# EAGLE design source_eagle (EAGLE 9.2.2)
COMPANY: ADAFRUIT INDUSTRIES; DRAWN: KTOWN; REV: B
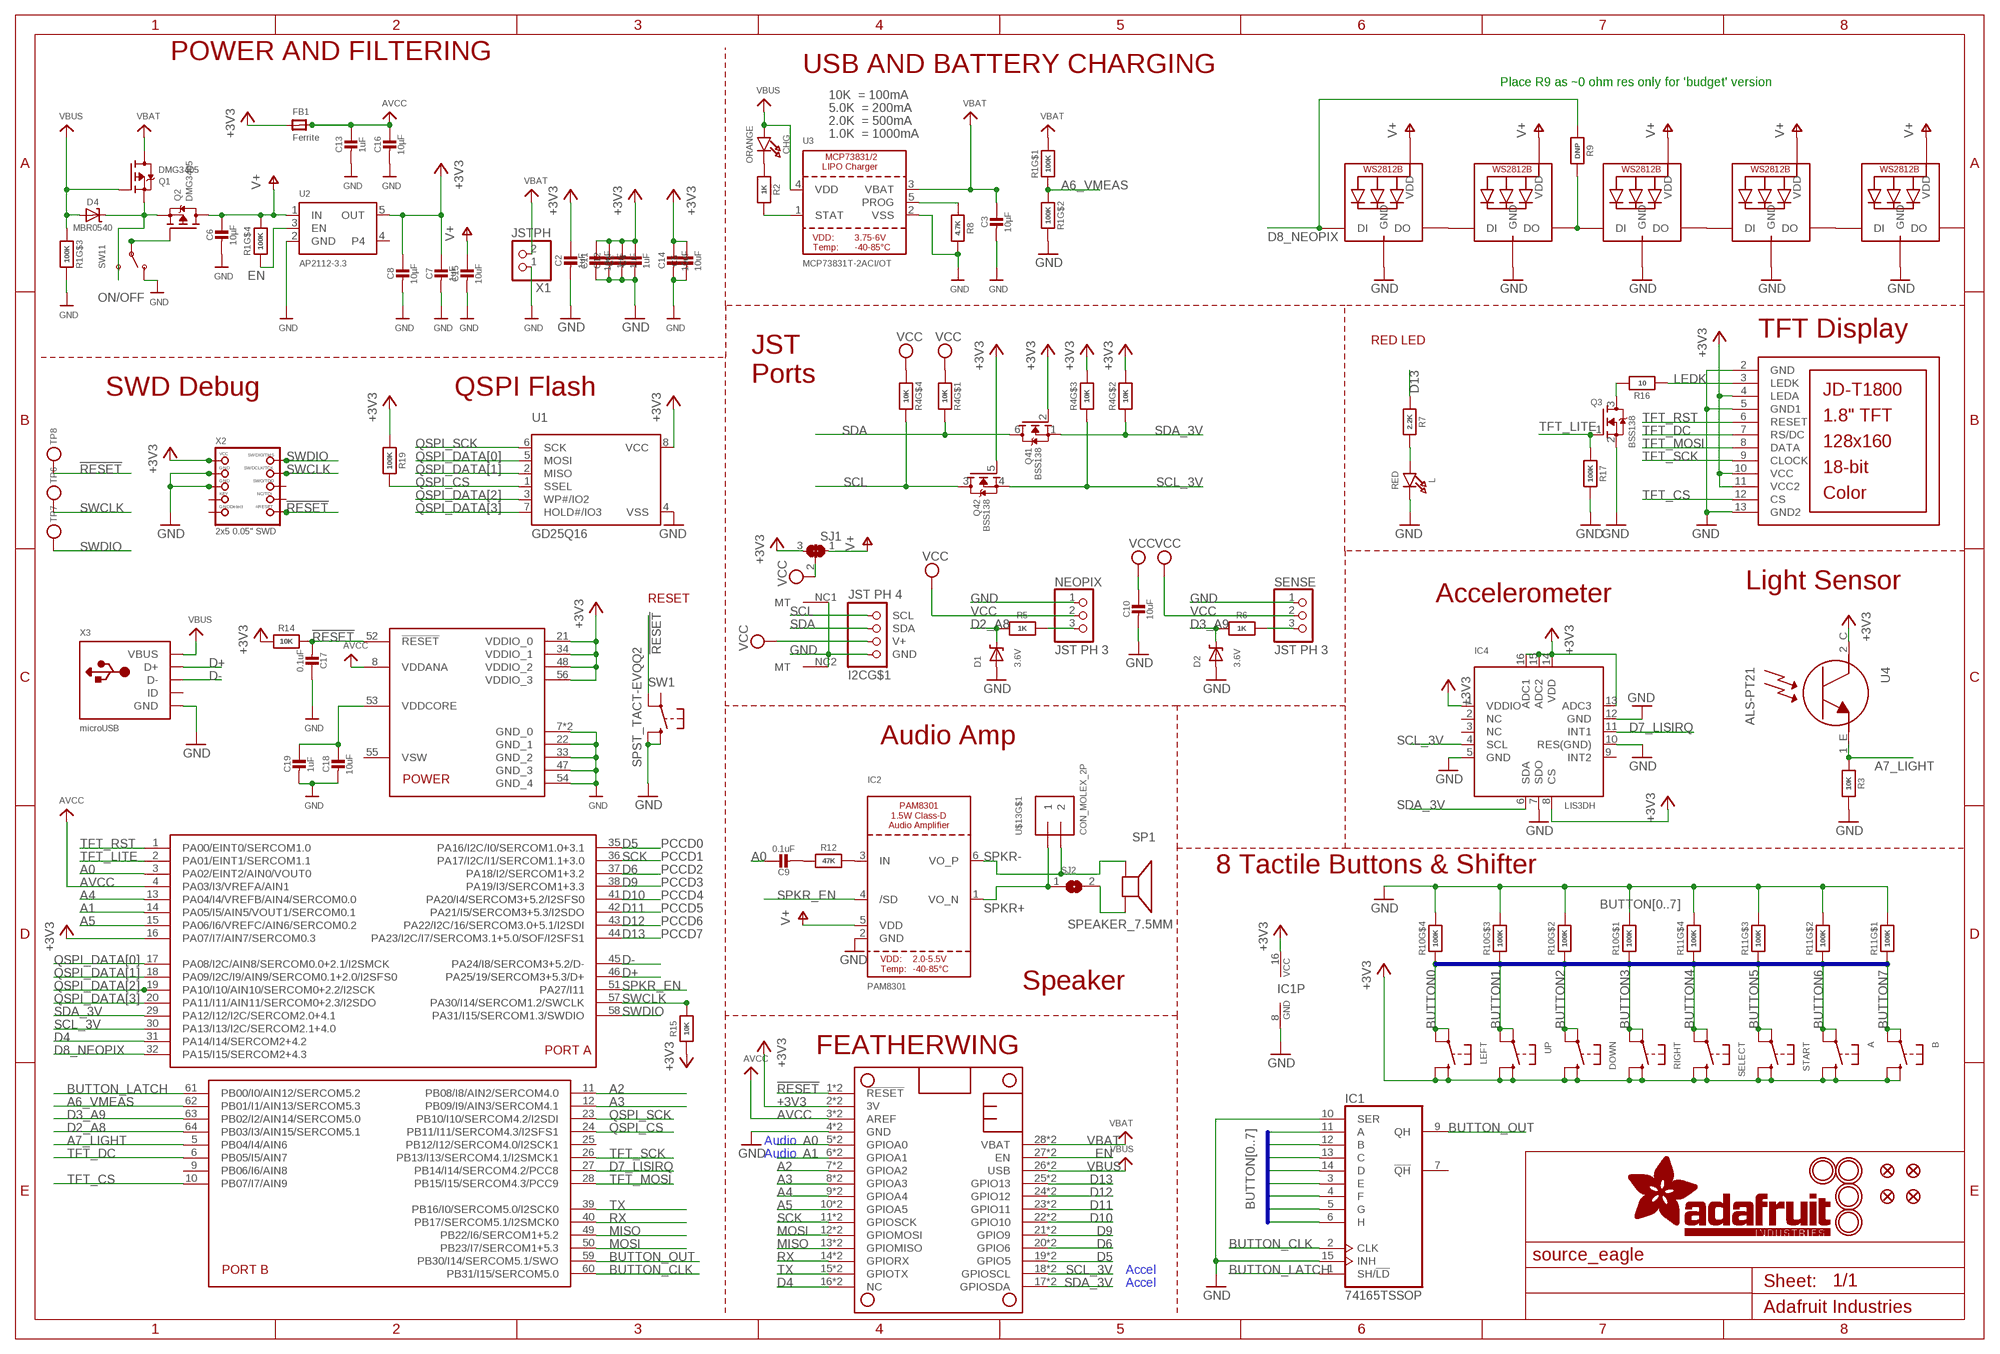
[diagram p0: schematic, sheet 1]

## Parts
A  SWITCH_TACT_SMT_6MMSMALL  [6MM_SMT]
B  SWITCH_TACT_SMT_6MMSMALL  [6MM_SMT]
C1  1uF  CAP_CERAMIC0603_NO  [0603-NO]
C2  1uF  CAP_CERAMIC0603_NO  [0603-NO]
C3  10µF  CAP_CERAMIC0805-NOOUTLINE  [0805-NO]
C4  1uF  CAP_CERAMIC0603_NO  [0603-NO]
C5  10uF  CAP_CERAMIC0805-NOOUTLINE  [0805-NO]
C6  10µF  CAP_CERAMIC0805-NOOUTLINE  [0805-NO]
C7  1uF  CAP_CERAMIC0603_NO  [0603-NO]
C8  10µF  CAP_CERAMIC0805-NOOUTLINE  [0805-NO]
C9  0.1uF  CAP_CERAMIC0603_NO  [0603-NO]
C10  10uF  CAP_CERAMIC0805-NOOUTLINE  [0805-NO]
C11  10uF  CAP_CERAMIC0805-NOOUTLINE  [0805-NO]
C12  1uF  CAP_CERAMIC0603_NO  [0603-NO]
C13  1uF  CAP_CERAMIC0603_NO  [0603-NO]
C14  10uF  CAP_CERAMIC0805-NOOUTLINE  [0805-NO]
C15  10uF  CAP_CERAMIC0805-NOOUTLINE  [0805-NO]
C16  10µF  CAP_CERAMIC_0805MP  [_0805MP]
C17  0.1uF  CAP_CERAMIC0603_NO  [0603-NO]
C18  10uF  CAP_CERAMIC0805-NOOUTLINE  [0805-NO]
C19  1uF  CAP_CERAMIC0603_NO  [0603-NO]
CHG  ORANGE  LED0805_NOOUTLINE  [CHIPLED_0805_NOOUTLINE]
D1  3.6V  DIODE-ZENERSOD323  [SOD-323]
D2  3.6V  DIODE-ZENERSOD323  [SOD-323]
D4  MBR0540  DIODE-SCHOTTKYSOD-123  [SOD-123]
DOWN  SWITCH_TACT_SMT_6MMSMALL  [6MM_SMT]
FB1  Ferrite  FERRITE-0805NO  [0805-NO]
I2C  JST PH 4  STEMMA_I2C_RASMT  [JSTPH4]
IC1  74165TSSOP  [TSSOP16]
IC2  PAM8301  [SOT23-6]
IC4  LIS3DH  ACCEL_LIS3DHTR  [LGA16_3X3MM]
L  RED  LED0805_NOOUTLINE  [CHIPLED_0805_NOOUTLINE]
LCD1  DISP_LCD_JDT1800  [JD-T1800]
LED1  WS2812B3535  [LED3535]
LED2  WS2812B3535  [LED3535]
LED3  WS2812B3535  [LED3535]
LED4  WS2812B3535  [LED3535]
LED5  WS2812B3535  [LED3535]
LEFT  SWITCH_TACT_SMT_6MMSMALL  [6MM_SMT]
MS1  FEATHERWING_SMTDUALNOHOLES  [FEATHERWING_SMT_NOHOLES]
NEOPIX  JST PH 3  CON_JST_PH_3PIN  [JSTPH3]
Q1  DMG3405  MOSFET-P  [SOT23-R]
Q2  DMG3405  MOSFET-P  [SOT23-R]
Q3  BSS138  MOSFET-NWIDE  [SOT23-WIDE]
Q4  BSS138  MOSFET-N_DUAL  [SOT363]
R1  100K  RESISTOR_4PACK  [RESPACK_4X0603]
R2  1K  RESISTOR_0603_NOOUT  [0603-NO]
R3  10K  RESISTOR_0603_NOOUT  [0603-NO]
R4  10K  RESISTOR_4PACK  [RESPACK_4X0603]
R5  1K  RESISTOR_0603_NOOUT  [0603-NO]
R6  1K  RESISTOR_0603_NOOUT  [0603-NO]
R7  2.2K  RESISTOR_0603_NOOUT  [0603-NO]
R8  4.7K  RESISTOR_0603_NOOUT  [0603-NO]
R9  DNP  RESISTOR_0603_NOOUT  [0603-NO]
R10  100K  RESISTOR_4PACK  [RESPACK_4X0603]
R11  100K  RESISTOR_4PACK  [RESPACK_4X0603]
R12  47K  RESISTOR_0603_NOOUT  [0603-NO]
R14  10K  RESISTOR_0603_NOOUT  [0603-NO]
R15  10K  RESISTOR_0603_NOOUT  [0603-NO]
R16  10  RESISTOR_0603_NOOUT  [0603-NO]
R17  100K  RESISTOR_0603_NOOUT  [0603-NO]
R19  100K  RESISTOR_0603_NOOUT  [0603-NO]
RIGHT  SWITCH_TACT_SMT_6MMSMALL  [6MM_SMT]
SELECT  SWITCH_TACT_SMT_6MMSMALL  [6MM_SMT]
SENSE  JST PH 3  CON_JST_PH_3PIN  [JSTPH3]
SJ1  SOLDERJUMPER_2WAY  [SOLDERJUMPER_2WAY_OPEN_NOPASTE]
SJ2  SOLDERJUMPERCLOSED  [SOLDERJUMPER_CLOSEDWIRE]
SP1  SPEAKER_7.5MM  [BUZZER_SMT_7.5MM]
START  SWITCH_TACT_SMT_6MMSMALL  [6MM_SMT]
SW1  SPST_TACT-EVQQ2  SWITCH_TACT_SMT_EVQQ2_SMALL  [EVQ-Q2_SMALLER]
SW11  SWITCH_SPDT  [SPDT_SMT_SSSS811101]
TP6  TESTPOINTROUND2MM  [TESTPOINT_ROUND_2MM]
TP7  TESTPOINTROUND2MM  [TESTPOINT_ROUND_2MM]
TP8  TESTPOINTROUND2MM  [TESTPOINT_ROUND_2MM]
U1  GD25Q16  SPIFLASH_8PIN208MIL  [SOIC8_208MIL]
U2  AP2112-3.3  VREG_SOT23-5  [SOT23-5]
U3  MCP73831T-2ACI/OT  MCP73831/2  [SOT23-5]
U4  ALS-PT21  PHOTOTRANSISTOR_PT26-21C  [ALS-PT26-21C]
U$5  MOUNTINGHOLE3.0THIN  [MOUNTINGHOLE_3.0_PLATEDTHIN]
U$6  MOUNTINGHOLE3.0THIN  [MOUNTINGHOLE_3.0_PLATEDTHIN]
U$13  CON_MOLEX_2P  [53398-0271]
U$15  MOUNTINGHOLE3.0THIN  [MOUNTINGHOLE_3.0_PLATEDTHIN]
U$17  MOUNTINGHOLE3.0THIN  [MOUNTINGHOLE_3.0_PLATEDTHIN]
U$24  ATSAMD51J19  ATSAMD51J  [PQFN64-1]
U$34  FIDUCIAL_1MM  [FIDUCIAL_1MM]
U$35  FIDUCIAL_1MM  [FIDUCIAL_1MM]
U$42  FIDUCIAL_1MM  [FIDUCIAL_1MM]
U$43  FIDUCIAL_1MM  [FIDUCIAL_1MM]
UP  SWITCH_TACT_SMT_6MMSMALL  [6MM_SMT]
X1  JSTPH  CON_JST_PH_2PIN  [JSTPH2]
X2  2x5 0.05" SWD  JTAG-CORTEXBOXPOSTS  [2X05_1.27MM_BOX_POSTS]
X3  microUSB  USB_MICRO_20329_V2  [4UCONN_20329_V2]

## Nets
!RESET: C17.2 MS1.1(!RESET) MS1.1B(!RESET) R14.2 SW1.A'(P1) TP8.P$1 U$24.52(!RESET) X2.10(NRESET)
+3V3 [power]: A.B'(S1) A.B(S) B.B'(S1) B.B(S) C1.1 C2.1 C4.1 C5.1 C7.1 C8.1 C11.1 C12.1 C14.1 DOWN.B'(S1) DOWN.B(S) FB1.1 IC1.16(VCC) IC4.1(VDDIO) IC4.8(CS) IC4.13(ADC3) IC4.14(VDD) IC4.15(ADC2) IC4.16(ADC1) LCD1.4(LEDA) LCD1.10(VCC) LCD1.11(VCC2) LEFT.B'(S1) LEFT.B(S) MS1.2(3V) MS1.2B(3V) Q4.2(1:G) Q4.5(2:G) R4.2 R4.3 R14.1 R15.1 R19.1 RIGHT.B'(S1) RIGHT.B(S) SELECT.B'(S1) SELECT.B(S) SJ1.3 START.B'(S1) START.B(S) U1.8(VCC) U2.5(OUT) U4.2_C(C) U$24.16(PA07/I7/AIN7/SERCOM0.3) U$24.21(VDDIO_0) U$24.34(VDDIO_1) U$24.48(VDDIO_2) U$24.56(VDDIO_3) UP.B'(S1) UP.B(S) X2.1(VCC)
A0: C9.1 MS1.5(GPIOA0) MS1.5B(GPIOA0) U$24.3(PA02/EINT2/AIN0/VOUT0)
A1: MS1.6(GPIOA1) MS1.6B(GPIOA1) U$24.14(PA05/I5/AIN5/VOUT1/SERCOM0.1)
A2: MS1.7(GPIOA2) MS1.7B(GPIOA2) U$24.11(PB08/I8/AIN2/SERCOM4.0)
A3: MS1.8(GPIOA3) MS1.8B(GPIOA3) U$24.12(PB09/I9/AIN3/SERCOM4.1)
A4: MS1.9(GPIOA4) MS1.9B(GPIOA4) U$24.13(PA04/I4/VREFB/AIN4/SERCOM0.0)
A5: MS1.10(GPIOA5) MS1.10B(GPIOA5) U$24.15(PA06/I6/VREFC/AIN6/SERCOM0.2)
A6_VMEAS: R1.1 R1.2 U$24.62(PB01/I1/AIN13/SERCOM5.3)
A7_LIGHT: R3.2 U4.1_E(E) U$24.5(PB04/I4/AIN6)
AVCC: C13.1 C16.1 FB1.2 MS1.3(AREF) MS1.3B(AREF) U$24.4(PA03/I3/VREFA/AIN1) U$24.8(VDDANA)
BUTTON0: IC1.11(A) LEFT.A'(P1) LEFT.A(P) R10.4
BUTTON1: IC1.12(B) R10.3 UP.A'(P1) UP.A(P)
BUTTON2: DOWN.A'(P1) DOWN.A(P) IC1.13(C) R10.2
BUTTON3: IC1.14(D) R10.1 RIGHT.A'(P1) RIGHT.A(P)
BUTTON4: IC1.3(E) R11.4 SELECT.A'(P1) SELECT.A(P)
BUTTON5: IC1.4(F) R11.3 START.A'(P1) START.A(P)
BUTTON6: A.A'(P1) A.A(P) IC1.5(G) R11.2
BUTTON7: B.A'(P1) B.A(P) IC1.6(H) R11.1
BUTTON_CLK: IC1.2(CLK) U$24.60(PB31/I15/SERCOM5.0)
BUTTON_LATCH: IC1.1(SH/!LD) U$24.61(PB00/I0/AIN12/SERCOM5.2)
BUTTON_OUT: IC1.9(QH) U$24.59(PB30/I14/SERCOM5.1/SWO)
CHG_LED: R2.2 U3.1(STAT)
CHG_RATE: R8.1 U3.5(PROG)
D2_: NEOPIX.3 R5.1
D2_A8: D1.C R5.2 U$24.64(PB03/I3/AIN15/SERCOM5.1)
D3_: R6.1 SENSE.3
D3_A9: D2.C R6.2 U$24.63(PB02/I2/AIN14/SERCOM5.0)
D4: MS1.16(NC) MS1.16B(NC) U$24.31(PA14/I14/SERCOM2+4.2)
D5: MS1.19(GPIO5) MS1.19B(GPIO5) U$24.35(PA16/I2C/I0/SERCOM1.0+3.1)
D6: MS1.20(GPIO6) MS1.20B(GPIO6) U$24.37(PA18/I2/SERCOM1+3.2)
D7_LISIRQ: IC4.11(INT1) U$24.27(PB14/I14/SERCOM4.2/PCC8)
D8_NEOPIX: LED1.1(DI) R9.1 U$24.32(PA15/I15/SERCOM2+4.3)
D9: MS1.21(GPIO9) MS1.21B(GPIO9) U$24.38(PA19/I3/SERCOM1+3.3)
D10: MS1.22(GPIO10) MS1.22B(GPIO10) U$24.41(PA20/I4/SERCOM3+5.2/I2SFS0)
D11: MS1.23(GPIO11) MS1.23B(GPIO11) U$24.42(PA21/I5/SERCOM3+5.3/I2SDO)
D12: MS1.24(GPIO12) MS1.24B(GPIO12) U$24.43(PA22/I2C/16/SERCOM3.0+5.1/I2SDI)
D13: MS1.25(GPIO13) MS1.25B(GPIO13) R7.1 U$24.44(PA23/I2C/I7/SERCOM3.1+5.0/SOF/I2SFS1)
D+: U$24.46(PA25/19/SERCOM3+5.3/D+) X3.D+
D-: U$24.45(PA24/I8/SERCOM3+5.2/D-) X3.D-
EN: MS1.27(EN) MS1.27B(EN) R1.4 U2.3(EN)
GND: C1.2 C2.2 C3.2 C4.2 C5.2 C6.2 C7.2 C8.2 C10.2 C11.2 C12.2 C13.2 C14.2 C15.2 C16.2 C17.1 C18.2 C19.2 D1.A D2.A I2C.1(GND) I2C.NC1(MT) I2C.NC2(MT) IC1.8(GND) IC1.10(SER) IC1.15(INH) IC2.2(GND) IC4.5(GND) IC4.7(SDO) IC4.10(RES(GND)) IC4.12(GND) L.C LCD1.2(GND) LCD1.5(GND1) LCD1.13(GND2) LED1.4(GND) LED2.4(GND) LED3.4(GND) LED4.4(GND) LED5.4(GND) MS1.4(GND) MS1.4B(GND) NEOPIX.1 Q3.2(S) R1.6 R1.7 R3.1 R8.2 R10.5 R10.6 R10.7 R10.8 R11.5 R11.6 R11.7 R11.8 R17.2 SENSE.1 SW1.B'(S1) SW1.B(S) SW11.A(O) U1.4(VSS) U2.2(GND) U3.2(VSS) U$24.7(GND_0) U$24.22(GND_1) U$24.33(GND_2) U$24.47(GND_3) U$24.54(GND_4) U$24.EXP(GND_0) X1.1 X2.3(GND) X2.5(GND) X3.BASE@1(GND) X3.BASE@2(GND) X3.GND X3.SPRT@1(GND) X3.SPRT@2(GND) X3.SPRT@3(GND) X3.SPRT@4(GND)
LEDK: LCD1.3(LEDK) R16.1
MISO: MS1.13(GPIOMISO) MS1.13B(GPIOMISO) U$24.49(PB22/I6/SERCOM1+5.2)
MOSI: MS1.12(GPIOMOSI) MS1.12B(GPIOMOSI) U$24.50(PB23/I7/SERCOM1+5.3)
N$1: CHG.C R2.1
N$2: L.A R7.2
N$3: LED1.3(DO) LED2.1(DI)
N$4: LED2.3(DO) LED3.1(DI) R9.2
N$5: LED3.3(DO) LED4.1(DI)
N$6: Q3.3(D) R16.2
N$7: LED4.3(DO) LED5.1(DI)
N$8: D4.C Q1.2(S) Q2.2(S) SW11.C(S)
N$9: C9.2 R12.1
N$10: IC2.3(IN) R12.2
N$12: SJ2.2 SP1.-
ON/OFF: Q2.1(G) SW11.B(P)
QSPI_CS: R19.2 U1.1(SSEL) U$24.24(PB11/I11/SERCOM4.3/I2SFS1)
QSPI_DATA[0]: U1.5(MOSI) U$24.17(PA08/I2C/AIN8/SERCOM0.0+2.1/I2SMCK)
QSPI_DATA[1]: U1.2(MISO) U$24.18(PA09/I2C/I9/AIN9/SERCOM0.1+2.0/I2SFS0)
QSPI_DATA[2]: U1.3(WP#/IO2) U$24.19(PA10/I10/AIN10/SERCOM0+2.2/I2SCK)
QSPI_DATA[3]: U1.7(HOLD#/IO3) U$24.20(PA11/I11/AIN11/SERCOM0+2.3/I2SDO)
QSPI_SCK: U1.6(SCK) U$24.23(PB10/I10/SERCOM4.2/I2SDI)
RX: MS1.14(GPIORX) MS1.14B(GPIORX) U$24.40(PB17/SERCOM5.1/I2SMCK0)
SCK: MS1.11(GPIOSCK) MS1.11B(GPIOSCK) U$24.36(PA17/I2C/I1/SERCOM1.1+3.0)
SCL: I2C.4(SCL) Q4.3(2:D) R4.5
SCL_3V: IC4.4(SCL) MS1.18(GPIOSCL) MS1.18B(GPIOSCL) Q4.4(2:S) R4.6 U$24.30(PA13/I13/I2C/SERCOM2.1+4.0)
SDA: I2C.3(SDA) Q4.6(1:D) R4.8
SDA_3V: IC4.6(SDA) MS1.17(GPIOSDA) MS1.17B(GPIOSDA) Q4.1(1:S) R4.7 U$24.29(PA12/I12/I2C/SERCOM2.0+4.1)
SPKR+: IC2.1(VO_N) SJ2.1 U$13.1
SPKR-: IC2.6(VO_P) SP1.+ U$13.2
SPKR_EN: IC2.4(/SD) U$24.51(PA27/I11)
SWCLK: R15.2 TP6.P$1 U$24.57(PA30/I14/SERCOM1.2/SWCLK) X2.4(SWDCLK)
SWDIO: TP7.P$1 U$24.58(PA31/I15/SERCOM1.3/SWDIO) X2.2(SWDIO)
TFT_CS: LCD1.12(CS) U$24.10(PB07/I7/AIN9)
TFT_DC: LCD1.7(RS/DC) U$24.6(PB05/I5/AIN7)
TFT_LITE: Q3.1(G) R17.1 U$24.2(PA01/EINT1/SERCOM1.1)
TFT_MOSI: LCD1.8(DATA) U$24.28(PB15/I15/SERCOM4.3/PCC9)
TFT_RST: LCD1.6(RESET) U$24.1(PA00/EINT0/SERCOM1.0)
TFT_SCK: LCD1.9(CLOCK) U$24.26(PB13/I13/SERCOM4.1/I2SMCK1)
TX: MS1.15(GPIOTX) MS1.15B(GPIOTX) U$24.39(PB16/I0/SERCOM5.0/I2SCK0)
V+ [power]: C6.1 C15.1 IC2.5(VDD) LED1.2(VDD) LED2.2(VDD) LED3.2(VDD) LED4.2(VDD) LED5.2(VDD) Q2.3(D) R1.5 SJ1.1 U2.1(IN)
VBAT [power]: C3.1 MS1.28(VBAT) MS1.28B(VBAT) Q1.3(D) R1.8 U3.3(VBAT) X1.2
VBUS: CHG.A D4.A MS1.26(USB) MS1.26B(USB) Q1.1(G) R1.3 U3.4(VDD) X3.VBUS
VCC [power]: C10.1 I2C.2(V+) NEOPIX.2 R4.1 R4.4 SENSE.2 SJ1.2
VDDCORE2: C18.1 C19.1 U$24.53(VDDCORE)
Unconnected: IC1.7(!QH) IC4.2(NC) IC4.3(NC) IC4.9(INT2) LED5.3(DO) SW1.A(P) U2.4 U$13.M1(MT) U$13.M2(MT) U$24.9(PB06/I6/AIN8) U$24.25(PB12/I12/SERCOM4.0/I2SCK1) U$24.55(VSW) X2.6(SWO) X2.7(KEY) X2.8(TDI) X2.9(GNDDETECT) X3.ID

## Buses
BUTTON[0..7]

## Notes on the sheet
- POWER AND FILTERING
- USB AND BATTERY CHARGING
- Place R9 as ~0 ohm res only for 'budget' version
- 10K  = 100mA
- 5.0K  = 200mA
- 2.0K  = 500mA
- 1.0K  = 1000mA
- TFT Display
- RED LED
- JST
  Ports
- SWD Debug | QSPI Flash
- Light Sensor
- RESET | Accelerometer
- Audio Amp
- PCCD0
- PCCD1
- PCCD2 | 8 Tactile Buttons & Shifter
- PCCD3
- PCCD4
- PCCD5
- PCCD6
- PCCD7
- Speaker
- FEATHERWING
- Audio
- Audio
- Accel
- Accel

## Library data of the parts
A B DOWN LEFT RIGHT SELECT START SW1 UP = microbuilder:SWITCH_TACT_SMT: SMT Tact Switches 6x6mm - Digikey: P12940SCT-ND KMR2 (4.6x2.8mm) - Digikey: 401-1426-1-ND EVQ-PQHB55 - Light Touch, 160GF (4.5x4.5mm) - Digikey: P8090SCT-ND KMT0 - KMT021 NGJ LHS (etc.) IP68/Waterproof - Digikey: CKN10289CT-ND
C1-C19 = microbuilder:CAP_CERAMIC: Ceramic Capacitors For new designs, use the packages preceded by an '_' character since they are more reliable: The following footprints should be used on most boards: _0402 - Standard footprint for regular board layouts _0603 - Standard footprint for regular board layouts _0805 - Standard footprint for regular board layouts _1206 - Standard footprint for regular board layouts For extremely tight-pitch boards where space is at a premium, the following 'micro-pitch' footprints can be used (smaller pads, no silkscreen outline, etc.): _0402MP - Micro-pitch footprint for very dense/compact boards _0603MP - Micro-pitch footprint for very dense/compact boards _0805MP - Micro-pitch footprint for very dense/compact boards _1206MP - Micro-pitch footprint for very dense/compact boards
CHG L = microbuilder:LED: LED 0603 - 0603 Surface Mount Package 2mA: Green LED - Low Power (3.9mcd, 2ma, 1.7Vf) - Digikey: 475-2709-2-ND Orange LED - Low Power (9.8mcd, 2ma, 1.8Vf) - Digikey: 475-1194-2-ND Red LED - Low Power (5mcd, 2ma, 1.8Vf) - Digikey: 475-1195-2-ND Yellow LED - Low Power (7mcd, 2ma, 1.8Vf) - Digikey: 475-1196-2-ND 5mA: Blue LED - Low Power (17mcd, 5ma, 2.9Vf) - Digikey: LNJ937W8CRACT-ND 0805 - 0805 Surface Mount Package 2mA: Red LED (8.8mcd, 2mA, 1.8Vf, Clear) - Low Power [Digikey: 475-2510-1-ND] Green LED (5mcd, 2mA, 1.8Vf, Clear) - Low Power [Digikey: 475-2730-1-ND] Yellow LED (11.3mcd, 2mA, 1.8Vf, Clear) - Low Power [Digikey: 475-2555-1-ND] 20mA: Red LED (104mcd, 20mA, Diffused) - LS R976 [Digikey: 475-1278-6-ND] Red LED (12mcd, 20mA, 2.0Vf, Clear) - APT2012EC [Digikey: 754-1128-1-ND] Green LED (15mcd, 20mA, 2.2Vf, Clear) - APT2012GC [Digikey: 754-1131-1-ND] Orange LED (160mcd, 20mA, 2.1Vf, Clear) - APT2012SECK [Digikey: 754-1130-1-ND] 1206 - 1206 Surface Mount Package Green LED (26mcd, 20mA, Diffused) - LG N971 [Digikey: 475-1407-6-ND] Red LED (15mcd, 20mA, Diffused) - LH N974 [Digikey: 475-1416-6-ND] Cree - Cree High-Power Surface Mount LEDs XPEBWT-L1-0000-00D50 - White 111lm 350mA 2.9Vf 6200K 110° XTEAWT-00-0000-00000LEE3 - White 114lm 350mA 2.85Vf 5000K 115° Everlight - Everlight 45-21 Series Surface Mount LEDs 45-21/QK2C-B2832AC2CB2/2T - Warm White 2000mcd 20mA 3.25Vf 3050K 120° 45-21/LK2C-B38452C4CB2/2T - Nuetral White 2000mcd 20mA 3.25Vf 4150K 120° 45-21/LK2C-B50634C6CB2/2T - Cold White 2200mcd 20mA 3.25Vf 5650K 120° PLCC2 Reverse Mount LS T77K-J1L2-1-0-2-R18-Z - Red 11.25mcd 2mA 1.8Vf 630nm 120° LO T77K-L1M2-24-Z - Orange 19.6mcd 2mA 1.8Vf 606nm 120° LY T77K-K2M1-26-Z - Yellow 15.7mcd 2mA 1.8Vf 587nm 120°
D1 D2 = microbuilder:DIODE-ZENER: Zener Diode SMA: 30V 1W Zener Diode, 1.2Vf - Digikey: SMAZ30-FDICT-ND
D4 = microbuilder:DIODE-SCHOTTKY
FB1 = microbuilder:FERRITE: Ferrite Bead 0603 MMZ1608B121C - 120 Ohm @ 100MHz, 600mA, 0.15 Ohm DC Resistance - Digikey: 445-2164-1-ND BK1608HW121-T - 120 Ohm, 600mA Ferrite Chip - Digikey: 587-1876-2-ND 0805 HZ0805B272R-10 - 2.7K Ohm @ 100MHz, 200mA, 0.8 Ohm DC Resistance - Digikey: 240-2504-1-ND (see also Murata BLM21BD272SN1L) MMZ2012Y152B - 1.5K Ohm @ 100MHz, 500mA, 0.4 Ohm DC Resistance - Digikey: 445-1560-1-ND - Mainly for high frequency (80-400MHz) MMZ2012R102A - 1K Ohm @ 100MHz, 500mA, 0.3 Ohm DC Resistance - Digikey: 445-1555-2-ND - More general purpose (10-200MHz)
I2C = microbuilder:STEMMA_I2C
IC1 = microbuilder:74*165: 8-bit parallel load SHIFT REGISTER
IC2 = microbuilder:PAM8301
IC4 = microbuilder:ACCEL_LIS3DHTR: LIS3DHTR 3-Axis Accelerometer with I2C/SPI Interface VDD: 1.71-3.6V VDDIO: 1.71-VDD+0.1V Scale: +/-2g, 4g, 8g, 16g with 16--bit data output Temp:: -40°C - 85°C Mouser: 511-LIS3DHTR Digikey: 497-10613-1-ND
LCD1 = microbuilder:DISP_LCD_JDT1800
LED1-LED5 = microbuilder:WS2812B
MS1 = microbuilder:FEATHERWING
NEOPIX SENSE = microbuilder:CON_JST_PH_3PIN
Q1 Q2 = microbuilder:MOSFET-P: P-Channel Mosfet LEGEND VDS: Voltage Drain-Source ID: Drain Current RDS(ON): Drain-Source On-State Resistance VGS(TH): Gate-Source Threshold Voltage CISS: Drain-Source Input Capacitance SOT-23 Name VDS ID RDS(ON) VGS(TH) CISS Order Number IRLML5103 30V 760mA 600 mOhm -- 75pF @ 25V Digikey: IRLML5103PBFCT-ND IRLML6401 12V 4.3A 50 mOhm 950mV @ 250µA 830pF @ 10V Digikey: IRLML6401PBFTR-ND NTR0202PL 20V 400mA 800 mOhm 2.3V @ 250uA 70pF @ 5V Digikey: NTR0202PLT1GOSTR-ND NTR4101PT1G 20V 1.8A 85 mOhm 1.2V @ 250uA 675pF @ 10V Digikey: NTR4101PT1GOSCT-ND DMP2004K 20V 600mA 900 mOhm 1V @ 250uA 175pF @ 16V Digikey: DMP2004KDICT-ND PMV65XP 20V 3.9A 76 mOhm 950mV @ 1mA 725pF @ 20V Digikey: 568-2358-2-ND TO-252 Name VDS ID RDS(ON) VGS(TH) CISS Order Number AOD417 30V 25A 34 mOhm 3V @ 250µA 920pF @ 15V Digikey: 785-1106-2-ND PowerPak Name VDS ID RDS(ON) VGS(TH) CISS Order Number AON7401 30V 12A 14 mOhm 3V @ 250µA 2600pF @ 15V Digikey: 785-1302-1-ND
Q3 = microbuilder:MOSFET-N: N-Channel Mosfet LEGEND VDS: Voltage Drain-Source ID: Drain Current RDS(ON): Drain-Source On-State Resistance VGS(TH): Gate-Source Threshold Voltage CISS: Drain-Source Input Capacitance SOT-23 Name VDS ID RDS(ON) VGS(TH) CISS Order Number 2N7002E 60V 260mA 2.5 Ohm 2.5V @ 250uA 26.7pF @ 25V 2N7002ET1GOSTR-ND BSH103 30V 850mA 400 mOhm 400mV @ 1mA 83pF @ 24V BSH103,235-ND BSS138 60V 320mA 1.6 Ohm 1.5V @ 250uA 50pF @ 10V Mouser: 771-BSS138PW115 DMN2075U-7 20V 4.2A 38 mOhm 1V @ 250 uA 594.3pF @ 10V DMN2075U-7DICT-ND * BSS138 good choice for I2C level-shifting POWERPAK 1212-8 Name VDS ID RDS(ON) VGS(TH) CISS Order Number Si7308DN 60V 6A 58 mOhm 3V @ 250uA 665pF @ 15V SI7308DN-T1-E3CT-ND
Q4 = microbuilder:MOSFET-N_DUAL: Dual N-Channel MOSFET SOT363 (2.0x1.25mm) 2N7002PS - 60V, 320mA [Digikey: 568-5984-1-ND]
R1 R4 R10 R11 = microbuilder:RESISTOR_4PACK: Resistor Packs (4 resistors) 4 x 0603 10K 1/16W - Digikey: YC164J-10KCT-ND
R2 R3 R5-R9 R12 R14-R17 R19 = microbuilder:RESISTOR: Resistors For new designs, use the packages preceded by an '_' character since they are more reliable: The following footprints should be used on most boards: _0402 - Standard footprint for regular board layouts _0603 - Standard footprint for regular board layouts _0805 - Standard footprint for regular board layouts _1206 - Standard footprint for regular board layouts For extremely tight-pitch boards where space is at a premium, the following 'micro-pitch' footprints can be used (smaller pads, no silkscreen outline, etc.): _0402MP - Micro-pitch footprint for very dense/compact boards _0603MP - Micro-pitch footprint for very dense/compact boards _0805MP - Micro-pitch footprint for very dense/compact boards _1206MP - Micro-pitch footprint for very dense/compact boards
SJ1 = microbuilder:SOLDERJUMPER_2WAY: 2-Way Solder Jumper
SJ2 = microbuilder:SOLDERJUMPER: SMD Solder JUMPER Solder the two pads together to create a connection, or remove the solder to break it. REFLOW - Use this footprint for solder paste and reflow ovens. WAVE - Use this footprint for hand-soldering (larger pads). CLOSED - Has a trace between the two pads to ensure it is closed by default. The trace needs to be cut to disable the jumper, and can be closed again by creating a solder bridge between the two pads.
SP1 = microbuilder:SPEAKER: SPEAKER Source: Buerklin Added PS12 (for part # PS1240 piezo) http://www.ladyada.net/library/pcb/eaglelibrary.html
SW11 = microbuilder:SWITCH_SPDT: Switch - SPDT SSSS811101 - Horizontal Two Position SMT, 0.3A 4V [Mouser: 688-SSSS811101]
TP6-TP8 = microbuilder:TESTPOINT: Test Point Various test points for characterisation and PCB testing TESTPOINT_SMT - Compact Surface Mount Test Point [Digikey: 5016KTR-ND]
U1 = microbuilder:SPIFLASH_8PIN: SOIC8 SPI Flash Be careful with the size since SOIC8 flash comes in several 'widths' SOIC8 150 mil M25P16 - 16Mbit (2Mbit x 8) Serial Flash (75MHz SPI Bus), Supply: 2.7-3.6V Digikey: SOIC8 - M25P16-VMN6P-ND SOIC8 208 mil W25Q16BVSSIG - 16Mbit (2Mbit x 8) Serial Flash (104MHz SPI Bus), Supply: 2.7-3.6V Digikey: SOIC8 - W25Q16BVSSIG-ND
U2 = microbuilder:VREG_SOT23-5: SOT23-5 Fixed Voltage Regulators Part Current Out V Out V In V Dropout θJA (°C/W) TJ (°C) Digikey Part No. ADP121 150mA 3.3V 3.4-5.5V 0.09V @ 150mA -- -- ADP121-AUJZ33R7CT-ND ADP121 150mA 3.0V 3.1-5.5V 0.09V @ 150mA -- -- ADP121-AUJZ30R7CT-ND ADP122 300mA 3.3V 3.4-5.5V 0.085V @ 300mA -- -- ADP122AUJZ-3.3-R7CT-ND ADP1712 300mA 3.3V 3.5-5.5V 0.17V @ 300mA -- -- ADP1712AUJZ-3.3-R7TR-ND AP7311 (Low Cost) 150mA 3.3V 3.5-6V 0.15V @ 150mA -- -- AP7311-33WG-7DICT-ND LD39015M18R 150mA 1.8V 1.9V-5.5V 0.08V @ 100mA -- -- 497-6977-1-ND LP2985A-33DBVR 150mA 3.3V 3.3-16V 0.28V @ 150mA 206 150 296-18479-1-ND MCP1824T-3302E/OT 300mA 3.3V 3.5V-6V 0.2V @ 300mA -- -- MCP1824T-3302E/OTCT-ND MIC5205-2.5YM5 TR 150mA 2.5V 2.7-16V 0.165V @ 150mA -- -- 576-1257-2-ND MIC5205-3.0YM5 TR 150mA 3.0V 3.2V-16V 0.165V @ 150mA -- -- 576-1258-2-ND MIC5205-3.3YM5 TR 150mA 3.3V 3.5V-16V 0.165V @ 150mA -- -- 576-1259-2-ND TPS780330220 150mA 3.3V+2.2V 3.6-5.5V 250mV Max -- -- 296-23332-1-ND TDA3663/N1,135 100mA 3.3V 3.5-45V 0.18V @ 50mA -- -- 568-5343-1-ND Max operating temp can be calculated using θJA, TJ (max junction temperature), and power in watts. Set the "Maximum Ambient Temperature" until it reaches TJ ("Max Junction Temperature"), which is the absolute limit for safe use of the regulator: Heat Sink Temperature Calculator For example, With 12V source into a 3.3V LP2985 and a 30mA load, we are dissipating (12V-3.3V) * 0.03A = 0.261W. With a θJA of 206 °C/W, a TJ of 150°C, and 261mW we can safely use the chip without a heat sink up to 75°C (=147.1°C Junction Temperature).
U3 = microbuilder:MCP73831/2: MCP73831/2 LIPO Charger VDD: 3.75 - 6V Temp -40 - 85°C Programmable Charge Rate: 15-500mA NOTE: STAT is a tri-state logic output on the MCP73831 and an open-drain output on the MCP73832. SOT23-5 with 4.2V output and tri-state logic on STAT = MCP73831T-2ACI/OT
U4 = microbuilder:PHOTOTRANSISTOR: ALS-PT19-315C - Analog Light Sensor VCC: 2.5-5.5V
U$5 U$6 U$15 U$17 = microbuilder:MOUNTINGHOLE: Mounting Hole For #2 screws (0.086"/2.18mm width, 0.094"/2.4mm hole) use 2.5mm; BOM: EXCLUDE
U$13 = microbuilder:CON_MOLEX_2P
U$24 = microbuilder:ATSAMD51J: ATSAMD51J cortex m4 microcontroller
U$34 U$35 U$42 U$43 = microbuilder:FIDUCIAL: Fiducial Alignment Points Various fiducial points for machine vision alignment.; BOM: EXCLUDE
X1 = microbuilder:CON_JST_PH_2PIN: JST 2-Pin Right-Angle Connector PH-Series - 4UConnector: 17311 SH-Series - 4UConnector: 07278
X2 = microbuilder:JTAG-CORTEX: Serial Wire (SW-DP) Connector Standard 0.05" 10-pin connector is for use with the Cortex M and Cortex A SWD (serial wire debugger) interface (SW-DP) Connectors 2x05_1.27MM_SMT - Inexpensive surface-mount header with bare pins, compatible with standard 10-pin SWD cables (4UCON: 16846) 2x05_1.27MM_BOX_NOPOSTS - Polarised surface-mount box (4UCON with caps: 19735, without caps: 15117 2x05_1.27MM_BOX_POSTS - Polarised surface-mount box with mounting holes (4UCON: 20317) Pinout: http://infocenter.arm.com/help/topic/com.arm.doc.faqs/attached/13634/cortex_debug_connectors.pdf http://www.keil.com/peripherals/coresight/connectors.asp
X3 = microbuilder:USB: USB Connectors USBMINIB - Surface Mount Female Mini-B USB Connector 4UConnector: 06564

## Net classes
1 power: width 0.305 mm
2 gnd: width 0.254 mm

## Board
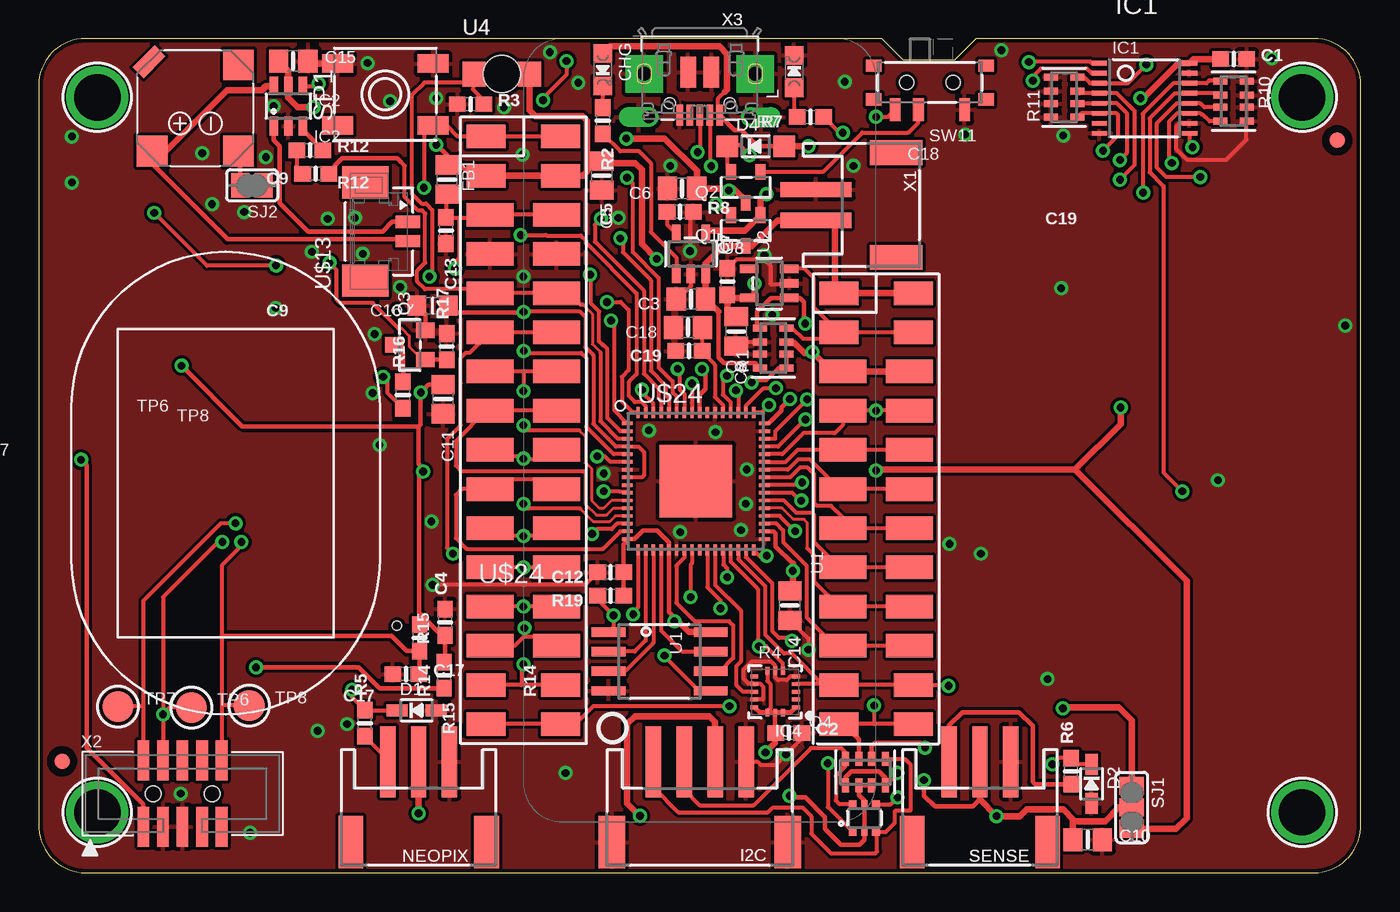
[diagram p1: board, top side]
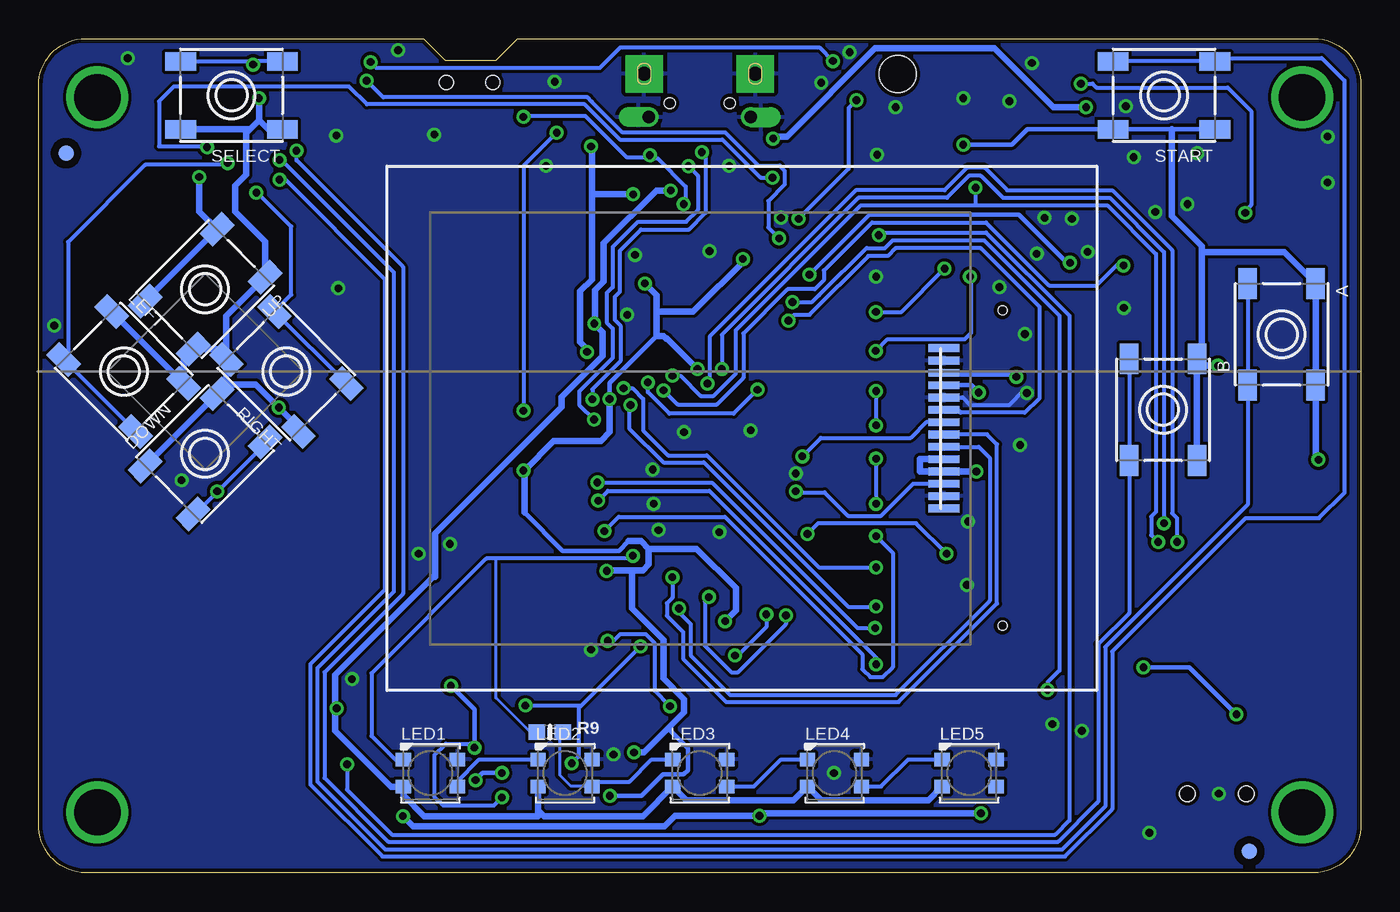
[diagram p2: board, bottom side, seen from below]

Size 85.72 x 54.1 mm. Coordinates in mm from the lower left corner, seen from the top.
Outline: 0,51.05 0,3.17 arc90 3.05,0 82.68,0 arc90 85.72,3.17 85.72,51.05 arc90 82.68,54.1 60.77,54.1 59.37,52.71 56.07,52.71 54.67,54.1 3.05,54.1 arc90 0,51.05
Copper layers (1*16): Top 0.035mm / dielectric 1.5mm / Bottom 0.035mm
Design rules "adafruit *": minimum track width 8mil, minimum drill 19mil, track to track 8mil, track to pad 8mil, pad to pad 8mil, via to via 8mil, smd to smd 8mil, copper to edge 10mil, drill to drill 8mil, minimum pad ring 10mil, minimum via ring 8mil, stop-mask expansion 2mil, vias tented up to drill 20mil, thermal gap 10mil

### Footprints (pad centres in the part's own frame; a part is rotated, then mirrored left to right if it is on the bottom)
6MM_SMT = smd 2 x 1.2: A -3.3,-2.2; A' 3.3,-2.2; B -3.3,2.2; B' 3.3,2.2
0603-NO = smd 1.075 x 1: 1 -0.85,0; 2 0.85,0
0805-NO = smd 1.24 x 1.5: 1 -0.95,0; 2 0.95,0
_0805MP = smd 1.2 x 1.3: 1 -1.016,0; 2 1.016,0
CHIPLED_0805_NOOUTLINE = smd 1.2 x 1.2: A 0,-1.05; C 0,1.05
SOD-323 = smd 1.35 x 0.8: A 1.27,0; C -1.27,0
SOD-123 = smd 1.4 x 1.4: A 1.85,0; C -1.85,0
JSTPH4 = smd 1 x 4.6: 1 -3,-3.7; 2 -1,-3.7; 3 1,-3.7; 4 3,-3.7 | smd 1.7 x 3.4: NC1 -5.7,1.5; NC2 5.7,1.5
TSSOP16 = smd 0.305 x 0.991: 1 -2.275,-2.918; 2 -1.625,-2.918; 3 -0.975,-2.918; 4 -0.325,-2.918; 5 0.325,-2.918; 6 0.975,-2.918; 7 1.625,-2.918; 8 2.275,-2.918; 9 2.275,2.918; 10 1.625,2.918; 11 0.975,2.918; 12 0.325,2.918; 13 -0.325,2.918; 14 -0.975,2.918; 15 -1.625,2.918; 16 -2.275,2.918
SOT23-6 = smd 0.55 x 1.2: 1 -0.95,-1.3; 2 0,-1.3; 3 0.95,-1.3; 4 0.95,1.3; 5 0,1.3; 6 -0.95,1.3
LGA16_3X3MM = smd 0.5 x 0.25: 1 -1.35,1; 2 -1.35,0.5; 3 -1.35,0; 4 -1.35,-0.5; 5 -1.35,-1; 9 1.35,-1; 10 1.35,-0.5; 11 1.35,0; 12 1.35,0.5; 13 1.35,1 | smd 0.25 x 0.5: 6 -0.5,-1.35; 7 0,-1.35; 8 0.5,-1.35; 14 0.5,1.35; 15 0,1.35; 16 -0.5,1.35
JD-T1800 = smd 0.5 x 2: 1 5.2,-13.1; 2 4.4,-13.1; 3 3.6,-13.1; 4 2.8,-13.1; 5 2,-13.1; 6 1.2,-13.1; 7 0.4,-13.1; 8 -0.4,-13.1; 9 -1.2,-13.1; 10 -2,-13.1; 11 -2.8,-13.1; 12 -3.6,-13.1; 13 -4.4,-13.1; 14 -5.2,-13.1 | hole 0.6: -12.8,-16.9; 7.65,-16.9
LED3535 = smd 1 x 0.85: 1 -1.75,0.875; 2 -1.75,-0.875; 3 1.75,-0.875; 4 1.75,0.875
FEATHERWING_SMT_NOHOLES = smd 1.524 x 2.54: 1 6.35,2.413; 1B 6.35,-2.413; 2 8.89,2.413; 2B 8.89,-2.413; 15 41.91,2.413; 15B 41.91,-2.413; 16 44.45,2.413; 16B 44.45,-2.413; 17 44.45,20.447; 17B 44.45,25.273; 18 41.91,20.447; 18B 41.91,25.273; 27 19.05,20.447; 27B 19.05,25.273; 28 16.51,20.447; 28B 16.51,25.273 | smd 1.524 x 3.048: 3 11.43,2.159; 3B 11.43,-2.159; 4 13.97,2.159; 4B 13.97,-2.159; 5 16.51,2.159; 5B 16.51,-2.159; 6 19.05,2.159; 6B 19.05,-2.159; 7 21.59,2.159; 7B 21.59,-2.159; 8 24.13,2.159; 8B 24.13,-2.159; 9 26.67,2.159; 9B 26.67,-2.159; 10 29.21,2.159; 10B 29.21,-2.159; 11 31.75,2.159; 11B 31.75,-2.159; 12 34.29,2.159; 12B 34.29,-2.159; 13 36.83,2.159; 13B 36.83,-2.159; 14 39.37,2.159; 14B 39.37,-2.159; 19 39.37,20.701; 19B 39.37,25.019; 20 36.83,20.701; 20B 36.83,25.019; 21 34.29,20.701; 21B 34.29,25.019; 22 31.75,20.701; 22B 31.75,25.019; 23 29.21,20.701; 23B 29.21,25.019; 24 26.67,20.701; 24B 26.67,25.019; 25 24.13,20.701; 25B 24.13,25.019; 26 21.59,20.701; 26B 21.59,25.019
JSTPH3 = smd 1 x 4.6: 1 -2,-2.7; 2 0,-2.7; 3 2,-2.7 | smd 1.6 x 3.4: NC1 -4.4,2.5; NC2 4.4,2.5
SOT23-R = smd 0.635 x 1.016: 1 -0.95,-1; 2 0.95,-1; 3 0,1
SOT23-WIDE = smd 1 x 1.2: 1 -0.95,-1; 2 0.95,-1; 3 0,1
SOT363 = smd 0.5 x 0.5: 1 -0.75,-0.9; 3 0.75,-0.9; 4 0.75,0.9; 6 -0.75,0.9 | smd 0.4 x 0.5: 2 0,-0.9; 5 0,0.9
RESPACK_4X0603 = smd 0.45 x 0.9: 1 -1.3,-0.85; 2 -0.4,-0.85; 3 0.4,-0.85; 4 1.3,-0.85; 5 1.3,0.85; 6 0.4,0.85; 7 -0.4,0.85; 8 -1.3,0.85
SOLDERJUMPER_2WAY_OPEN_NOPASTE = smd 1.168 x 1.6: 1 -1.397,0; 2 0,0; 3 1.397,0
SOLDERJUMPER_CLOSEDWIRE = smd 1.168 x 1.6: 1 -0.762,0; 2 0.762,0 | smd 0.635 x 0.203: WIRE 0,0
BUZZER_SMT_7.5MM = smd 2 x 2: + 2.8,-2.8; - 2.8,2.8; MT2 -2.8,2.8 | smd 2 x 1 rotated 135: MT -3,-3
EVQ-Q2_SMALLER = smd 2 x 1.2: A -3.1,-2; A' 3.1,-2; B -3.1,2; B' 3.1,2
SPDT_SMT_SSSS811101 = smd 0.7 x 1.5: A -2.25,1.75; B 0.75,1.75; C 2.25,1.75 | smd 1 x 0.8: SUP1 -3.65,1.1; SUP2 -3.65,-1.1; SUP3 3.65,1.1; SUP4 3.65,-1.1 | hole 0.9: -1.5,0; 1.5,0
TESTPOINT_ROUND_2MM = smd 2 x 2: P$1 0,0
SOIC8_208MIL = smd 0.6 x 2.2: 1 -1.905,-3.315; 2 -0.635,-3.315; 3 0.635,-3.315; 4 1.905,-3.315; 5 1.905,3.315; 6 0.635,3.315; 7 -0.635,3.315; 8 -1.905,3.315
SOT23-5 = smd 0.55 x 1.2: 1 -0.95,-1.3; 2 0,-1.3; 3 0.95,-1.3; 4 0.95,1.3; 5 -0.95,1.3
ALS-PT26-21C = smd 1.5 x 1.6: 1_E -1.8,0; 2_C 1.8,0 | hole 2.4: 0,0
MOUNTINGHOLE_3.0_PLATEDTHIN = drill 3 pad 3.6: P$1 0,0
53398-0271 = smd 0.8 x 1.6: 1 0.625,-1.27; 2 -0.625,-1.27 | smd 2.1 x 3: M1 3.185,1.48; M2 -3.185,1.48
PQFN64-1 = smd 0.7 x 0.22: 1 -4.45,3.75; 2 -4.45,3.25; 3 -4.45,2.75; 4 -4.45,2.25; 5 -4.45,1.75; 6 -4.45,1.25; 7 -4.45,0.75; 8 -4.45,0.25; 9 -4.45,-0.25; 10 -4.45,-0.75; 11 -4.45,-1.25; 12 -4.45,-1.75; 13 -4.45,-2.25; 14 -4.45,-2.75; 15 -4.45,-3.25; 16 -4.45,-3.75; 33 4.45,-3.75; 34 4.45,-3.25; 35 4.45,-2.75; 36 4.45,-2.25; 37 4.45,-1.75; 38 4.45,-1.25; 39 4.45,-0.75; 40 4.45,-0.25; 41 4.45,0.25; 42 4.45,0.75; 43 4.45,1.25; 44 4.45,1.75; 45 4.45,2.25; 46 4.45,2.75; 47 4.45,3.25; 48 4.45,3.75 | smd 0.22 x 0.7: 17 -3.75,-4.45; 18 -3.25,-4.45; 19 -2.75,-4.45; 20 -2.25,-4.45; 21 -1.75,-4.45; 22 -1.25,-4.45; 23 -0.75,-4.45; 24 -0.25,-4.45; 25 0.25,-4.45; 26 0.75,-4.45; 27 1.25,-4.45; 28 1.75,-4.45; 29 2.25,-4.45; 30 2.75,-4.45; 31 3.25,-4.45; 32 3.75,-4.45; 49 3.75,4.45; 50 3.25,4.45; 51 2.75,4.45; 52 2.25,4.45; 53 1.75,4.45; 54 1.25,4.45; 55 0.75,4.45; 56 0.25,4.45; 57 -0.25,4.45; 58 -0.75,4.45; 59 -1.25,4.45; 60 -1.75,4.45; 61 -2.25,4.45; 62 -2.75,4.45; 63 -3.25,4.45; 64 -3.75,4.45 | smd 4.7 x 4.7: EXP 0,0
FIDUCIAL_1MM = smd 1 x 1: 1 0,0
JSTPH2 = smd 1 x 4.6: 1 -1,-3.7; 2 1,-3.7 | smd 1.6 x 3.4: NC1 -3.4,1.5; NC2 3.4,1.5
2X05_1.27MM_BOX_POSTS = smd 0.76 x 2.6: 1 -2.54,-2.15; 2 -2.54,2.15; 3 -1.27,-2.15; 4 -1.27,2.15; 5 0,-2.15; 6 0,2.15; 7 1.27,-2.15; 8 1.27,2.15; 9 2.54,-2.15; 10 2.54,2.15 | hole 1: -1.905,0; 1.905,0
4UCONN_20329_V2 = smd 1 x 2: BASE@1 -0.75,-2; BASE@2 0.75,-2 | smd 0.4 x 1.35: D+ 0,0.775; D- -0.65,0.775; GND 1.3,0.775; ID 0.65,0.775; VBUS -1.3,0.775 | drill 0.8 pad 1.143 offset: SPRT@1 -3.3,0.9; SPRT@2 3.3,0.9 | drill 0.9 pad 2.413 square: SPRT@3 -3.6,-1.9; SPRT@4 3.6,-1.9 | hole 0.7: -1.95,0; 1.95,0

### Placement (x,y rotation side)
A  5.14,34.93 270 bottom
B  12.83,30.04 270 bottom
C1  77.47,52.77 0 top
C2  48.64,9.08 0 top
C3  42.29,37.21 180 top
C4  26.35,16.26 90 top
C5  36.51,45.21 270 top
C6  41.72,44.39 180 top
C7  44.66,38.34 90 top
C8  45.23,35.12 270 top
C9  17.97,45.34 180 top
C10  68.01,2.16 0 top
C11  26.23,30.72 270 top
C12  37.08,19.49 180 top
C13  26.42,41.66 270 top
C14  48.7,17.34 270 top
C15  16.51,52.64 0 top
C16  25.55,36.78 180 top
C17  23.81,12.89 0 top
C18  42.1,35.37 180 top
C19  42.16,33.85 180 top
CHG  36.58,52.07 180 top
D1  24.51,10.54 0 top
D2  68.26,5.78 270 top
D4  46.48,47.12 0 top
DOWN  74.93,27.18 45 bottom
FB1  26.48,44.96 270 top
I2C  42.86,3.49 180 top
IC1  71.69,50.23 270 top
IC2  16.19,49.72 0 top
IC4  47.75,11.75 180 top
L  48.98,51.97 0 top
LCD1  40.13,28.83 90 bottom
LED1  60.33,6.48 0 bottom
LED2  51.59,6.48 0 bottom
LED3  42.86,6.48 0 bottom
LED4  34.13,6.48 0 bottom
LED5  25.4,6.48 0 bottom
LEFT  80.2,32.51 315 bottom
MS1  31.43,54.1 270 top
NEOPIX  24.64,4.51 180 top
Q1  45.85,41.66 180 top
Q2  45.85,44.45 180 top
Q3  24.08,34.24 90 top
Q4  53.53,3.56 0 top
R1  47.62,34.04 90 top
R2  36.58,48.77 270 top
R3  28,49.85 0 top
R4  53.59,6.54 0 top
R5  21.15,9.72 90 top
R6  66.93,6.6 90 top
R7  50.04,49.02 180 top
R8  41.59,42.86 0 top
R9  52.58,9.14 0 bottom
R10  77.47,50.04 270 top
R11  66.48,50.29 90 top
R12  17.59,46.86 0 top
R14  24.7,15.24 270 top
R15  26.29,12.83 270 top
R16  23.62,30.99 90 top
R17  26.45,34.12 90 top
R19  37.08,17.97 180 top
RIGHT  69.66,32.51 135 bottom
SELECT  73.22,50.42 180 bottom
SENSE  61.02,4.51 180 top
SJ1  70.87,4.25 270 top
SJ2  13.84,44.58 180 top
SP1  10.16,49.59 270 top
START  12.76,50.42 180 bottom
SW1  22.48,50.48 0 top
SW11  57.78,51.24 180 top
TP6  9.91,10.73 0 top
TP7  5.14,10.79 0 top
TP8  13.65,10.86 0 top
U1  40.26,13.72 270 top
U2  47.37,38.23 90 top
U3  42.29,40.13 0 top
U4  30.03,51.8 0 top
U$5  3.81,50.29 0 top
U$6  81.92,50.29 0 top
U$8  [SPEAKER_OVAL8OHM]  12.13,25.27 90 top
U$13  22.67,41.59 90 top
U$15  3.81,3.94 0 top
U$17  81.92,3.94 0 top
U$18  [PYBADGE_TOP]  85.72,0.13 0 bottom
U$24  42.61,25.4 0 top
U$32  [PYBADGE_BOT]  0,0.13 0 top
U$34  1.52,7.24 270 top
U$35  84.18,47.51 270 top
U$37  [PCBFEAT-REV-040]  37.21,9.4 0 top
U$42  83.95,46.67 0 bottom
U$43  7.24,1.4 0 bottom
UP  74.93,37.85 225 bottom
X1  54.1,43.31 270 top
X2  9.33,5.14 0 top
X3  42.86,49.91 180 top

### Tracks (layer width: path | path; a pad name or v marks a point on that pad's centre or on a via)
!RESET  (via drill 0.5)
  Top 0.254: v44.62,32.24 44.37,31.99 44.37,31.01 44.86,30.52 U$24.52 | 11.87,10.86 11.87,15.37 11.87,19.93 13.14,21.2 v13.14,21.46 | TP8.P$1 11.87,10.86 | MS1.1 MS1.1B 27.18,47.75 26.45,48.48 SW1.A' 24.98,47.88 v24.98,44.43 | 11.87,10.86 X2.10
  Top 0.305: C17.2 24.7,12.93 R14.2 23.87,14.39 22.89,15.37 11.87,15.37
  Bottom 0.254: v44.62,32.24 44.12,32.24 42.8,30.92 41.96,30.92 40.53,32.35 40.53,35.16 32.4,43.29 25.02,43.29 | v13.14,21.46 13.59,21.91 13.59,23.11 13.28,23.42 13.28,40.13 16.45,43.29 25.02,43.29 | v24.98,44.43 24.98,43.33 25.02,43.29
+3V3  (via drill 0.5)
  Top 0.254: IC4.8 47.25,12.45 47.45,12.25 47.45,10.66
  Top 0.305: 41.4,16.38 41.34,16.45 | 41.34,16.45 40.86,16.93 U$24.21 40.86,21.43 40.09,22.21 39.18,22.21 38.64,21.67 38.18,21.67 U$24.16 38.16,21.52 37.93,21.3 C12.1 R19.1 | U$24.34 47.64,22.15 47.78,22.01 47.78,21.18 48.9,20.06 | IC4.15 IC4.14 47.18,10.4 | IC4.15 IC4.16 48.75,10.4 IC4.1 | IC4.13 46.75,10.4 47.18,10.4 | 41.34,16.45 v41.21,16.32 | IC4.15 47.75,9.04 | 47.75,9.04 47.75,8.45 | U$24.56 42.86,30.99 43.24,31.37 43.24,32.45 v43.02,32.67 | 47.45,10.66 47.18,10.4 | C2.1 47.75,9.04 | X2.1 6.79,4.44 3.11,8.13 3.11,26.44 v2.75,26.8 | R4.3 R4.2 53.19,5.04 53.53,4.71 Q4.5 Q4.2 53.53,2.16 53.21,1.84 52.01,1.84 50.99,2.86 50.99,3.62 49.72,4.89 48.83,4.89 48.72,5 v48.69,5 | R15.1 26.35,13.74 C4.1 26.12,15.41 25.07,16.46 | v48.7,30.73 48.16,30.19 48.16,30 47.31,29.15 U$24.48 | 25.07,16.46 24.66,16.87 24.66,25.76 v24.93,26.04 | v9.27,32.89 13.21,28.96 24.64,28.96 | 25.07,16.46 R14.1 | MS1.2B 28.07,45.21 27.37,45.91 FB1.1 26.48,46.53 v25.78,47.23 | 24.64,28.96 24.75,29.07 24.75,31.13 v24.78,31.15 25.3,31.67 C11.1 | 24.64,28.96 24.64,26.5 25.02,26.12
  Top 0.406: C8.1 44.66,36.64 C7.1 44.87,37.28 U2.5 46.42,37.28 v46.42,38.23 | MS1.2B MS1.2 35.31,45.21 35.56,45.47 35.56,46.16 | 41.4,16.38 42.16,15.62 U1.8 | 35.56,46.16 35.56,48.76 35.26,49.06 32.22,49.06 31.83,49.45 U4.2_C | 35.56,46.16 C5.1 36.64,46.04 38.67,46.04 39.12,45.59 39.12,40.77 v40.07,39.82 | v71.44,50.23 71.63,50.23 73.9,52.5 IC1.16 74.87,52.77 C1.1 | 47.75,8.45 v47.12,7.81 | v54.29,26.1 54.34,26.15 67.19,26.15 | 25.02,26.12 v24.93,26.04 | 67.19,26.15 70.15,29.11 v70.15,30.18 | C14.1 48.9,18.48 v48.9,19.58 v48.9,19.59 48.9,20.06 | SJ1.3 73.72,2.86 74.42,3.56 74.42,18.92 67.19,26.15
  Bottom 0.305: v48.7,30.73 48.7,31.75 45.66,34.8 | 54.23,23.37 51.75,20.89 48.11,20.89 47.47,21.53 | v48.69,5 46.65,5 45.26,6.38 43.91,6.38 43.62,6.67 43.62,8.06 44.93,9.37 | START.B 12.26,48.22 START.B' 21.63,48.22 22.62,47.23 v25.78,47.23 | LCD1.4 25.25,31.63 v24.78,31.15
  Bottom 0.406: v40.07,39.82 39.88,39.82 43.31,36.39 45.66,36.39 | 45.66,36.39 45.66,34.8 45.2,34.8 45.05,34.64 44.98,34.64 v43.02,32.67 | v46.42,38.23 45.66,37.47 45.66,36.39 | v47.12,7.81 46.48,7.81 44.93,9.37 43.88,10.42 43.88,11.26 45.22,12.61 45.22,15.11 47.24,17.14 47.24,19.63 | 54.23,26.1 52.32,28 49.28,28 48.7,28.57 v48.7,30.73 | v54.29,26.1 54.23,26.1 | 54.23,26.1 54.23,23.37 | LCD1.10 28.57,26.83 28.57,26.04 LCD1.11 v24.94,26.03 v24.93,26.04 | 47.24,19.63 46.54,19.63 46.17,20 46.17,21.02 | 46.17,21.02 43.06,21.02 40.51,18.48 40.51,17.02 v41.21,16.32 | DOWN.B DOWN.B' 73.55,31.67 | LEFT.B LEFT.B' 76.31,33.35 UP.B' 74.22,33.96 RIGHT.B' | 47.47,21.53 46.67,21.53 46.17,21.02 | 47.24,19.63 48.85,19.63 v48.9,19.58 | v71.44,50.23 71.44,48.8 | 12.26,48.22 12.26,42.58 10.32,40.64 10.32,40.26 | 71.44,48.8 72.02,48.22 | 72.02,48.22 SELECT.B' | 71.44,48.8 70.86,48.22 SELECT.B | 72.02,48.22 72.26,47.98 72.26,45.28 72.97,44.57 72.97,42.87 71.04,40.94 UP.B 73.55,36.12 RIGHT.B' | v2.75,26.8 2.94,26.99 A.B' A.B 4.98,40.26 10.32,40.26 | RIGHT.B' 73.55,31.67 | 73.55,31.67 71.65,31.67 v70.15,30.18 68.88,28.91 RIGHT.B | 10.32,40.26 10.32,33.64 B.B | B.B' B.B | B.B 10.18,32.89 v9.27,32.89
A0
  Top 0.203: 35.29,36.84 35.9,36.23 35.9,34.29 36.42,33.77
  Top 0.254: U$24.3 37.57,28.15 36.42,29.3 36.42,33.77 | 35.29,36.84 35.17,36.84 34.42,37.59 MS1.5 MS1.5B 29.02,37.85 25.05,37.85 24.55,38.35 24.55,39.05 25.07,39.57 25.07,42.75 24.88,42.95 24.62,42.95 23.74,43.82 23.74,45.86 23.5,46.1
  Top 0.305: C9.1 19.2,45.72 19.2,45.87 19.68,46.36 23.24,46.36 23.5,46.1
A1  (via drill 0.5)
  Top 0.254: MS1.6 MS1.6B 27.94,33.72 27.69,33.72 27.37,33.4 27.37,31.75 27.37,29.02 26.48,28.13 26.48,21.08 v26.86,20.7 | U$24.14 37.51,22.65 37.15,22.29 36.2,22.29 v35.88,21.98
  Bottom 0.254: v26.86,20.7 28.84,22.67 35.19,22.67 v35.88,21.98
A2  (via drill 0.5)
  Top 0.203: U$24.11 37.14,24.15 36.63,23.64 36.37,23.64 35.85,24.15 35.85,26.21 35.46,26.6 35.46,28.3 35.05,28.7
  Top 0.254: 31.43,32.51 MS1.7B | MS1.7 31.43,32.51 | 35.05,28.7 31.75,28.7 v31.43,29.02 | 31.43,32.51 v31.43,31.24
  Bottom 0.254: v31.43,31.24 v31.43,29.02
A3
  Top 0.203: U$24.12 37.27,23.65 36.83,23.21 36.16,23.21 35.43,23.93 35.43,25.91 35.31,26.04
  Top 0.254: MS1.8 MS1.8B 29.02,29.97 27.05,28 27.05,26.42 27.43,26.04 35.31,26.04
A4  (via drill 0.5)
  Top 0.203: 35.12,23.62 35.97,22.77 37.02,22.77 37.4,23.15 U$24.13
  Top 0.254: MS1.9 32.96,26.8 31.5,26.8 v31.43,26.86 31.43,26.99 29.72,26.99 MS1.9B | 35.12,23.62 31.75,23.62 v31.43,23.94
  Bottom 0.254: v31.43,26.86 v31.43,23.94
A5
  Top 0.254: MS1.10 32.96,25.53 29.91,25.53 MS1.10B 27.43,24.89 27.05,24.51 27.05,21.72 27.75,21.02 36.58,21.02 37.71,22.15 U$24.15
A6_VMEAS  (via drill 0.5)
  Top 0.254: R1.2 R1.1 47.97,32.74 47.17,31.94 46.35,31.94 v46.23,31.81 | U$24.62 39.86,30.42 39.12,31.16 v39.12,31.34
  Bottom 0.254: v39.12,31.34 40.67,29.78 44.83,29.78 46.23,31.18 v46.23,31.81
A7_LIGHT  (via drill 0.5)
  Top 0.254: U$24.5 37.28,27.15 35.51,28.92 35.51,33.39 35.18,33.72 31.58,33.72 v31.45,33.85 | R3.2 28.85,50.1 28.16,50.79 28.16,51.73 U4.1_E 27.68,51.24 25.02,51.24 24.2,50.42 24.2,44.04 24.83,43.41 25.11,43.41 25.53,42.99 25.53,38.86 v25.34,38.67
  Bottom 0.254: v25.34,38.67 25.27,38.61 25.27,35.01 25.68,34.61 30.69,34.61 v31.45,33.85
AVCC  (via drill 0.5)
  Top 0.254: MS1.3 MS1.3B 29.11,42.51 27.3,42.51 C13.1 26.42,43.95 FB1.2 | v31.44,36.38 v31.43,36.39 35.1,36.39 35.45,36.04 35.45,34.1 35.97,33.58 35.97,29.11 37.43,27.65 U$24.4 38.9,27.65 39.24,27.3 39.24,25.78 39.12,25.65 U$24.8
  Top 0.305: v26.99,39.18 26.99,39.56 27.3,39.88 27.3,42.51 | v31.43,36.39 31.37,36.32 27.03,36.32 C16.1
  Bottom 0.254: v31.44,36.38 29.79,36.38 v26.99,39.18
BUTTON0  (via drill 0.5)
  Top 0.254: v73.47,46.04 73.28,46.23 73.28,48.71 73.83,49.25 IC1.11 75.32,49.25 75.39,49.18 75.47,49.18 75.91,48.74 R10.4
  Bottom 0.254: v73.47,46.04 73.47,45.91 78.8,45.91 83.81,40.91 83.81,33.57 LEFT.A LEFT.A'
BUTTON1  (via drill 0.5)
  Top 0.254: v75.31,45.13 73.11,45.13 72.5,45.74 72.5,48.62 73.79,49.91 IC1.12 | R10.3 75.58,49.64 75.31,49.91 IC1.12 | IC1.12
  Bottom 0.406: UP.A' UP.A 75.31,42.89 v75.31,45.13
BUTTON2  (via drill 0.5)
  Top 0.254: R10.2 76.5,50.55 IC1.13 73.67,50.55 72.04,48.92 72.04,45.43 72.92,44.54 72.92,25.98 v74.15,24.75
  Bottom 0.254: DOWN.A' 71.04,27.83 74.12,24.75 | v74.15,24.75 74.12,24.75 | DOWN.A 75.58,23.29 74.12,24.75
BUTTON3  (via drill 0.5)
  Top 0.254: R10.1 76.59,51.37 75.88,51.37 75.72,51.2 IC1.14 73.56,51.2 71.58,49.23 71.58,44.14 v71.61,44.11
  Bottom 0.254: RIGHT.A RIGHT.A' 69.34,37.5 69.34,41.91 71.55,44.11 v71.61,44.11
BUTTON4  (via drill 0.5)
  Top 0.254: R11.4 67.79,51.59 68.18,51.2 IC1.3 70.6,51.2 v71.82,52.42
  Bottom 0.254: SELECT.A 71.62,52.62 | 71.62,52.62 v71.82,52.42 | SELECT.A' 71.62,52.62
BUTTON5  (via drill 0.5)
  Top 0.254: v70.1,44.96 71.06,45.91 71.06,49.4 69.91,50.55 IC1.4 67.47,50.55 R11.3
  Bottom 0.254: v70.1,44.96 69.72,44.96 63.28,38.52 63.28,18.35 68.11,13.52 68.11,5.74 63.44,1.07 19.18,1.07 16.12,4.13 16.12,14.35 7.46,23 2.72,23 1.08,24.65 1.08,51.37 2.54,52.83 9.25,52.83 START.A START.A'
BUTTON6  (via drill 0.5)
  Top 0.254: v70.1,46.23 70.55,46.67 70.55,49.26 69.91,49.9 IC1.5 68.52,49.9 67.35,49.9 R11.2
  Bottom 0.254: A.A A.A' 7.34,23.88 16.57,14.65 16.57,4.32 19.37,1.52 63.25,1.52 67.65,5.93 67.65,13.27 62.7,18.22 62.7,38.95 69.98,46.23 v70.1,46.23
BUTTON7  (via drill 0.5)
  Top 0.254: v69,46.83 69.98,47.8 69.98,49.15 69.87,49.25 IC1.6 67.6,49.25 R11.1
  Bottom 0.254: B.A B.A' 15.03,16.84 17.03,14.84 17.03,4.62 17.11,4.55 | 17.11,4.55 19.62,2.03 63.06,2.03 67.18,6.16 67.18,13.02 62.1,18.1 62.1,39.31 69,46.21 v69,46.83 | 17.11,4.55
BUTTON_CLK  (via drill 0.5)
  Top 0.254: v64.45,51.37 64.45,51.62 64.97,52.15 67.97,52.15 68.27,51.85 IC1.2 | v37.72,41.15 37.88,40.98 37.88,40.24 39.7,38.43 39.7,32.56 40.65,31.61 40.65,30.97 40.86,30.76 U$24.60
  Bottom 0.254: v64.45,51.37 63.37,50.29 50.14,50.29 49.87,50.02 47.86,48.01 41.2,48.01 39.06,45.87 37.69,45.87 37.36,45.54 37.36,44.63 38.42,43.58 38.42,41.85 v37.72,41.15
BUTTON_LATCH  (via drill 0.5)
  Top 0.254: v36.45,42.42 36.07,42.04 36.07,40.93 39.24,37.75 39.24,32.37 40.19,31.42 40.19,30.78 40.36,30.61 U$24.61 | IC1.1 68.26,52.5 68.16,52.61 64.23,52.61 v64.2,52.58 | v32.7,50.1 32.7,50.23 34.23,51.75 v34.23,52.64
  Bottom 0.254: v36.45,42.42 33.21,45.66 33.21,49.59 v32.7,50.1 | v64.2,52.58 63.83,52.21 49.33,52.21 48.01,53.53 35.12,53.53 v34.23,52.64
BUTTON_OUT  (via drill 0.5)
  Top 0.254: v74.8,47.05 74.61,47.25 IC1.9 | U$24.59 41.36,30.91 41.1,31.16 41.1,31.87 40.2,32.78 40.2,38.58 38.53,40.24 38.53,44.7 v38.14,45.09
  Bottom 0.254: v38.14,45.09 38.92,45.09 41.39,47.55 48.05,47.55 50.33,49.83 50.33,49.84 64.44,49.84 65.62,51.01 76.94,51.01 77.92,50.04 77.92,47.12 74.87,47.12 v74.8,47.05
CHG_LED
  Top 0.254: U3.1 41.34,39.91 39.69,41.56 39.69,46.04 38.92,46.8 37.72,46.8 36.6,47.92 R2.2
CHG_RATE
  Top 0.254: R8.1 40.74,42.03 U3.5
D2_
  Top 0.254: R5.1 22.64,7.37 NEOPIX.3
D2_A8  (via drill 0.5)
  Top 0.254: U$24.64 38.54,29.85 37.81,30.58 37.81,32.16 38.25,32.6 38.25,36.51 37.74,37.02 v36.85,37.02 | v20.32,11.88 20.32,11.39 R5.2 21.17,10.54 D1.C
  Bottom 0.254: v36.85,37.02 35.58,37.02 35.15,37.45 35.13,37.45 32.05,40.53 30.86,40.51 30.35,41.02 24.44,41.02 19.55,36.13 19.55,13.13 20.32,12.36 v20.32,11.88
D3_
  Top 0.305: SENSE.3 59.02,9.56 59.88,10.41 63.56,10.41 64.45,9.53 64.45,5.91 64.6,5.75 R6.1
D3_A9  (via drill 0.5)
  Top 0.254: U$24.63 39.36,30.28 39.1,30.53 38.66,30.53 38.28,30.91 38.28,31.85 38.77,32.34 38.77,37.58 35.48,40.86 35.48,40.99 35.14,41.34 32.89,41.34 32.87,41.36 v31.26,41.36 | D2.C 67.33,7.05 R6.2 66.13,7.45 v65.72,7.05
  Bottom 0.254: v31.26,41.36 31.09,41.53 24.3,41.53 18.9,36.13 18.9,3.4 19.81,2.49 62.81,2.49 65.72,5.4 v65.72,7.05
D4  (via drill 0.5)
  Top 0.254: MS1.16B MS1.16 34.8,9.65 35.96,10.81 v44.78,10.81 | U$24.31 45.86,20.48 47.55,18.79 47.55,15.69 48,15.24 48.64,15.24 v48.83,15.05
  Bottom 0.254: v48.83,15.05 48.45,15.05 48,15.49 46.37,15.49 45.8,14.92 45.8,11.83 v44.78,10.81
D5
  Top 0.254: MS1.19B MS1.19 51.63,14.73 49.78,16.57 49.78,19.94 48.26,21.46 48.26,22.22 47.83,22.65 U$24.35
D6
  Top 0.203: U$24.37 48.19,23.65 48.92,22.92 49.62,22.92 49.82,22.72 49.82,21.07
  Top 0.254: MS1.20B MS1.20 51.92,17.27 50.28,18.91 50.28,20.62 49.82,21.07
D7_LISIRQ
  Top 0.254: IC4.11 45.66,11.75 45.21,12.19 45.21,13.4 45.53,13.72 45.53,17.02 43.86,18.69 U$24.27
D8_NEOPIX  (via drill 0.5)
  Top 0.254: U$24.32 46.87,20.43 47.01,20.57 v47.2,20.57
  Bottom 0.203: R9.1 53.87,9.14 56.07,11.34 56.07,20.38
  Bottom 0.254: v47.2,20.57 47.39,20.38 56.07,20.38 56.71,20.38 64.14,12.95 64.14,8.89 62.6,7.35 LED1.1
D9
  Top 0.254: MS1.21B MS1.21 51.92,19.81 50.28,21.45 50.28,23.24 50.17,23.36 49.12,23.36 48.33,24.15 U$24.38
D10
  Top 0.254: MS1.22B MS1.22 52.13,23.04 51.37,23.8 50.47,23.8 50.28,23.99 50.28,25.86 49.85,26.29 49.36,26.29 48.72,25.65 U$24.41
D11
  Top 0.254: MS1.23B MS1.23 51.92,24.89 50.02,26.8 49.22,26.8 48.58,26.15 U$24.42
D12
  Top 0.254: MS1.24B MS1.24 49.21,27.43 48.43,26.65 U$24.43
D13  (via drill 0.5)
  Top 0.254: MS1.25B v54.29,29.97 MS1.25 52.13,29.03 51.63,28.52 49.58,28.52 48.21,27.15 U$24.44 | v52.13,48.01 52.02,47.89 R7.1
  Bottom 0.254: v52.13,48.01 54.29,45.85 v54.29,29.97
D+  (via drill 0.5)
  Top 0.254: v42.73,46.74 42.86,46.87 X3.D+ | v49.83,30.71 47.74,28.62 47.74,28.15 U$24.46
  Bottom 0.254: v42.73,46.74 42.48,46.48 42.48,42.8 43.56,41.72 46.67,41.72 48.06,40.34 48.06,37.67 48.39,37.34 48.39,35.88 48.01,35.5 48.01,33.19 49.83,31.37 v49.83,30.71
D-  (via drill 0.5)
  Top 0.254: v49.72,29.4 49.7,29.4 47.95,27.65 U$24.45 | X3.D- 43.51,45.91 v43.6,45.82
  Bottom 0.254: v43.6,45.82 42.99,45.21 42.99,42.99 43.75,42.23 46.86,42.23 48.51,40.58 48.51,37.97 48.9,37.59 48.9,35.69 48.51,35.31 48.51,33.39 50.67,31.23 50.67,30.35 v49.72,29.4
EN
  Top 0.254: MS1.27 51.47,34.64 49.55,34.64 48.86,35.34 R1.4 | U2.3 49.66,39.18 50.23,38.61 50.23,36.7 MS1.27 | MS1.27B MS1.27
GND  (via drill 0.5)
  Top 0.254: IC4.12 46.93,11.25 46.99,11.3 46.99,12.07 46.81,12.25 IC4.10 46.36,12.29 46.02,12.29 45.67,12.64 45.67,13.15 46.2,13.68 47.51,13.68 47.77,13.42 47.77,13.12 IC4.7 47.75,12.7 47.94,12.52 48.51,12.52 48.74,12.75 IC4.5 | R8.2 42.23,42.86 v42.23,40.32 | C3.2 41.47,37.21 42.29,38.04 42.29,38.1 | 42.29,38.1 | U3.2 42.29,38.1 | C7.2 45.25,39.78 47.02,39.78 47.43,39.37 47.43,38.23 47.5,38.16 48.61,38.16 U2.2 | R1.6 45.49,34.44 C8.2 | IC1.10 73.94,48.6 73.74,48.4 73.74,46.98 74.49,46.23 76.96,46.23 78.3,47.56 78.3,48.71 R10.5 | C12.2 36.23,19.47 35.43,18.67 25.72,18.67 25.55,18.5 v25.55,18.67 | I2C.1 46.63,7.19 46.79,7.03 47.79,7.03 v48.45,7.68 49.49,8.72 C2.2 | C14.2 49.91,15.18 v49.91,14.48
  Top 0.305: C16.2 25.08,36.24 Q3.2
  Top 0.406: C15.2 17.62,52.48 SW1.B
  Bottom 0.254: LCD1.5 25.81,30.83 25.34,30.35 22.8,30.35 21.84,31.3 v21.65,31.11
  other vias: 37.59,42.48 40.96,45.85 31.43,38.67 25.46,22.8 47.05,40.07 43.88,28.57 39.56,28.7 41.59,22.1 45.53,22.22 45.85,23.94 45.91,26.16 34.99,51.24 33.15,53.21 47.56,36.2 21.34,52.51 9.21,5.14 20,9.65 13.72,2.6 18.1,9.21 22.1,27.75 22.8,50.04 25.78,50.23 59.05,21.34 61.09,20.7 65.41,12.57 34.16,6.48 2.16,44.77 2.16,47.75 13.34,42.86 10.6,46.67 52.83,45.85 52.26,51.31 60.07,47.88 62.42,53.34 79.95,52.83 66.42,47.82 15.24,49.72 15.37,36.64 18.73,42.42 30.16,49.66 21.78,34.94 31.37,46.57 20.51,42.48 11.24,43.37 36.64,25.91 23.43,37.99 17.72,40.27 21.02,40.14 66.29,37.91 84.71,35.5 76.45,25.46 14.73,46.42
  pour Top: 0,54.1 85.72,54.1 85.72,0.13 0,0.13
  pour Bottom: 0,54.1 85.72,54.1 85.72,0.13 0,0.13
LEDK  (via drill 0.5)
  Top 0.254: R16.1 22.61,31.15 22.61,31.9 v22.34,32.16
  Bottom 0.254: v22.34,32.16 22.48,32.3 26.91,32.3 LCD1.3
MISO  (via drill 0.5)
  Top 0.254: MS1.13B v31.43,17.27 MS1.13 | v47.35,30.33 46.87,29.85 U$24.49
  Bottom 0.254: v47.35,30.33 47.43,30.25 47.43,28.83 45.23,26.62 42.6,26.62 33.23,17.25 31.45,17.25 v31.43,17.27
MOSI  (via drill 0.5)
  Top 0.254: MS1.12B v31.43,19.81 MS1.12 | v47.8,31.43 47,31.43 45.86,30.29 U$24.50
  Bottom 0.254: v47.8,31.43 47.23,31.43 46.53,30.74 46.53,28.69 44.92,27.08 42.41,27.08 35.14,19.81 v31.43,19.81
N$1
  Top 0.254: CHG.C R2.1
N$2
  Top 0.254: L.A 48.98,50.1 48.98,49.23 R7.2
N$3
  Bottom 0.254: LED2.1 57.16,7.35 58.58,5.94 LED1.3
N$4
  Bottom 0.203: LED2.3 49.89,5.65 51.24,5.65 51.94,6.35 51.94,8.93 R9.2
  Bottom 0.254: LED2.3 49.53,5.92 47.42,5.92 45.97,7.37 44.63,7.37 LED3.1
N$5
  Bottom 0.254: LED3.3 39.36,5.6 37.59,7.37 35.9,7.37 LED4.1
N$6
  Top 0.305: Q3.3 23.62,33.7 R16.2
N$7
  Bottom 0.254: LED4.3 31.1,5.6 29.34,7.37 27.16,7.37 LED5.1
N$8  (via drill 0.5)
  Top 0.254: Q2.2 44.63,45.72 D4.C 44.7,47.18 45.47,47.18 v46.1,46.55 | Q1.2 44.83,42.66 44.12,43.37 v43.9,43.37 | v54.29,49.02 55.06,49.02 SW11.C
  Bottom 0.254: v43.9,43.37 43.9,43.5 43.77,43.62 43.77,44.51 45.59,46.33 45.89,46.33 v46.1,46.55 46.23,46.42 47.62,46.42 50.29,49.09 54.29,49.09 v54.29,49.02
N$9
  Top 0.254: R12.1 16.74,45.72 C9.2
N$10
  Top 0.305: IC2.3 17.14,48.16 R12.2
N$11
  Top 0.254: 70.87,5.46 70.87,4.44
N$12
  Top 0.305: SP1.- 13.08,46.67 SJ2.2
ON/OFF
  Top 0.254: Q2.1 50.85,45.45 53.4,48.01 56.39,48.01 57.03,48.65 SW11.B
QSPI_CS  (via drill 0.5)
  Top 0.254: U1.1 37.27,15.95 v37.27,16.7 36.23,17.74 R19.2 | U$24.24 42.36,20.07 42.27,19.98 v42.27,17.89
  Bottom 0.254: v37.27,16.7 37.27,16.13 40.39,13.02 40.82,13.02 42.53,14.73 42.53,17.63 v42.27,17.89
QSPI_DATA[0]  (via drill 0.5)
  Top 0.254: U$24.17 38.86,17.2 38.61,16.95 38.61,16.83 v38.54,16.76 | U1.5 42.8,11.81 40.58,14.03 v40.58,14.1
  Bottom 0.254: v38.54,16.76 38.54,15.94 40.39,14.1 v40.58,14.1
QSPI_DATA[1]
  Top 0.254: U1.2 38.64,14.35 39.36,15.07 U$24.18
QSPI_DATA[2]
  Top 0.254: U$24.19 39.86,14.92 38.02,13.08 U1.3
QSPI_DATA[3]
  Top 0.254: U1.7 41.72,14.35 40.36,15.71 U$24.20
QSPI_SCK
  Top 0.254: U$24.23 41.86,20.44 41.35,19.93 41.35,17.51 42.55,16.32 44.77,16.32 45.02,16.07 45.02,13.93 44.17,13.08 U1.6
RX  (via drill 0.5)
  Top 0.254: MS1.14B 30.86,14.73 31.43,15.3 | MS1.14 33.02,15.3 31.43,15.3 | U$24.40 49.34,25.15 v49.5,25.31 | v31.5,15.88 31.5,15.37 31.43,15.3
  Bottom 0.254: v49.5,25.31 42.08,25.31 32.64,15.88 v31.5,15.88
SCK  (via drill 0.5)
  Top 0.254: MS1.11B 29.78,21.84 v31.43,21.84 33.08,21.84 MS1.11 | U$24.36 48.03,23.15 49.02,22.16 v49.05,22.16
  Bottom 0.254: v31.43,21.84 30.35,20.76 30.35,13.34 30.99,12.7 31.81,12.7 32.32,13.21 32.32,14.18 41.23,23.09 48.12,23.09 v49.05,22.16
SCL
  Top 0.254: I2C.4 39.86,5.54 41.47,3.94 47.3,3.94 47.58,4.21 49.55,4.21 50.1,3.66 50.1,2.54 51.37,1.27 54.23,1.27 54.36,1.4 54.36,2.58 Q4.3 54.92,2.66 55.49,3.23 55.49,3.97 55.56,4.04 56.52,4.04 56.52,7.05 56.2,7.37 55.08,7.37 55.05,7.39 R4.5
SCL_3V  (via drill 0.5)
  Top 0.254: MS1.18 MS1.18B 58.93,12.19 v58.99,12.13 | U$24.30 45.36,20.33 47.09,18.6 47.09,15.47 48.34,14.22 48.83,14.22 50.86,12.19 MS1.18 | IC4.4 51.82,12.25 MS1.18 | Q4.4 55.26,4.46 v55.69,4.89
  Top 0.305: R4.6 53.99,8.21 54.23,8.45 57.21,8.45 57.21,8.38 v57.47,8.13
  Bottom 0.254: v55.69,4.89 56.2,4.38 59.5,4.38 60.07,4.95 60.07,7.62 59.31,8.38 57.72,8.38 v57.47,8.13
  Bottom 0.305: v57.47,8.13 57.47,10.6 v58.99,12.13
SDA
  Top 0.254: I2C.3 41.86,5.38 42.85,4.39 46.37,4.39 50.06,8.09 52.04,8.09 52.29,7.83 R4.8 52.29,6.9 51.69,6.3 51.69,4.7 51.93,4.46 Q4.6
SDA_3V  (via drill 0.5)
  Top 0.254: MS1.17B 54.17,9.65 | 54.17,9.65 52.2,9.65 MS1.17 | U$24.29 44.86,20.19 46.63,18.41 46.63,15.15 46.7,15.09 v46.7,14.69 47.16,14.69 48.25,13.6 IC4.6 | v54.17,10.86 54.17,9.65 | Q4.1 51.16,4.28 v51.16,7.11
  Top 0.305: R4.7 53.19,8.66 52.2,9.65
  Bottom 0.254: 50.53,10.86 46.76,14.63 v46.7,14.69 | v54.17,10.86 50.53,10.86 | v46.7,14.69 | v51.16,7.11 50.72,7.56 50.72,10.67 50.53,10.86
SPKR+
  Top 0.305: U$13.1 22.91,42.22 22.29,41.59 17.46,41.59 15.62,43.43 15.62,44.7 | 15.62,44.7 15.62,47.12 15.24,47.5 IC2.1 | SJ2.1 14.73,44.7 15.62,44.7
SPKR-
  Top 0.305: U$13.2 23.94,41.02 23.88,41.09 12.26,41.09 7.36,45.98 SP1.+
  Top 0.406: SP1.+ 8.25,46.79 12.22,50.77 14.48,50.77 14.73,51.02 IC2.6
SPKR_EN  (via drill 0.5)
  Top 0.254: U$24.51 45.36,31.15 v45.21,31.3 | IC2.4 18,51.02 v18.16,51.18 | v7.49,42.8 10.92,39.37 15.37,39.37 v15.39,39.4
  Bottom 0.254: v45.21,31.3 44.3,30.38 41.76,30.38 40.04,32.1 40.04,34.98 37.17,37.85 35.41,37.85 34.82,38.44 34.82,39.06 31.7,42.18 24.3,42.18 20.22,38.1 17.14,38.1 15.85,39.4 v15.39,39.4 | v18.16,51.18 17.4,51.18 17.14,50.93 8.64,50.93 7.11,49.4 7.11,43.31 7.49,42.93 v7.49,42.8
SWCLK  (via drill 0.5)
  Top 0.254: U$24.57 42.36,30.48 42.35,30.49 v42.35,31.73 | v8.06,10.29 X2.4 | TP6.P$1 8.51,10.73 v8.06,10.29 | v8.06,10.29 8.06,17.89 11.64,21.46 v11.92,21.46
  Top 0.305: R15.2 22.1,11.98 20.74,13.34 v14.1,13.34
  Bottom 0.254: v42.35,31.73 42.23,31.86 42.23,34.78 32.74,44.27 26.99,44.27 25.54,45.72 24.38,45.72 22.92,44.26 16.12,44.26 12.24,40.39 12.24,23.31 11.92,22.99 v11.92,21.46
  Bottom 0.305: v14.1,13.34 11.11,13.34 v8.06,10.29
SWDIO  (via drill 0.5)
  Top 0.254: U$24.58 41.86,31.06 41.56,31.35 41.56,32.56 v41.44,32.68 | v12.76,22.67 11.81,22.67 6.79,17.65 6.79,10.79 | 6.79,10.79 X2.2 | 6.79,10.79 TP7.P$1
  Bottom 0.254: v41.44,32.68 41.44,34.91 32.57,43.77 26.84,43.77 25.4,45.21 24.64,45.21 23.2,43.77 16.28,43.77 12.76,40.26 v12.76,22.67
TFT_CS  (via drill 0.5)
  Top 0.254: U$24.10 38.1,24.71 37.67,24.71 37.64,24.74 v36.64,24.74
  Bottom 0.254: v36.64,24.74 36.57,24.68 34.78,24.68 33.25,23.16 31.11,23.16 29.04,25.23 LCD1.12
TFT_DC  (via drill 0.5)
  Top 0.254: U$24.6 37.08,26.65 36.99,26.73 36.71,27.01 v36.22,27.01
  Bottom 0.254: v36.22,27.01 35.01,28.22 29.19,28.22 28.18,29.23 LCD1.7
TFT_LITE  (via drill 0.5)
  Top 0.203: 23.32,35.3 23.55,35.3 24.03,34.82 24.03,34.14 24.88,33.29 Q3.1
  Top 0.254: 23.32,35.3 21.67,36.96 19.56,36.96 19.3,37.21 19.3,39.12 v18.86,39.56 | U$24.2 37.72,28.65 36.88,29.49 36.88,33.96 36.61,34.22 36.58,34.22 36.34,34.47 36.34,36.41 35.81,36.93 35.81,38.73 v35.75,38.8
  Top 0.305: Q3.1 26.44,33.29 R17.1
  Bottom 0.254: v35.75,38.8 31.88,42.67
  Bottom 0.305: 31.88,42.67 22.16,42.67 19.05,39.56 v18.86,39.56
TFT_MOSI  (via drill 0.5)
  Top 0.254: U$24.28 44.4,20.91 44.4,20 44.64,19.76 v44.64,19.18
  Bottom 0.254: v44.64,19.18 44.64,17.83 45,17.48 45,16.68 43.94,15.62 43.94,13.88 41.15,11.09 29.97,11.09 23.6,17.46 23.6,27.79 24.24,28.43 LCD1.8
TFT_RST  (via drill 0.5)
  Top 0.254: U$24.1 37.34,29.97 37.34,35.81 v37.12,35.81
  Bottom 0.254: 26.14,30.03 LCD1.6 | 25.95,29.84 21.79,29.84 20.83,30.8 20.83,36.7 24.64,40.51 30.16,40.51 30.67,40.01 31.93,40.01 35.74,36.2 36.74,36.2 v37.12,35.81
  Bottom 0.305: 25.95,29.84 26.14,30.03
TFT_SCK  (via drill 0.5)
  Top 0.254: v44.21,17.16 44.21,17.66 43.36,18.52 U$24.26
  Bottom 0.254: v44.21,17.16 44.35,17.02 43.46,16.13 43.46,14.11 40.89,11.54 30.16,11.54 24.05,17.65 24.05,26.91 24.77,27.63 LCD1.9
TX  (via drill 0.5)
  Top 0.254: 31.3,12.19 MS1.15B | MS1.15 31.3,12.19 | U$24.39 48.86,24.65 49.37,24.14 v49.45,24.14 | v31.43,13.53 31.3,13.4 31.3,12.19
  Bottom 0.254: v49.45,24.14 48.81,24.77 42.24,24.77 31.43,13.97 v31.43,13.53
V+  (via drill 0.5)
  Top 0.305: R1.5 46.58,35.53 46.58,36.4 47.47,37.28 U2.1 49.37,37.28 49.62,37.02 49.62,35.7 v49.7,35.62
  Top 0.406: Q2.3 45.91,43.51 45.04,44.39 44.9,44.39 | v38.1,47.62 40.57,47.62 42.67,45.53 C6.1 44.9,44.39 | v44.75,44.25 44.76,44.25 44.9,44.39 | v66.4,10.67 66.46,10.73 70.04,10.73 70.87,9.91 SJ1.1 | C15.1 16.19,52.01 IC2.5 16.19,50.27 16.8,49.66 v17.82,49.66
  Bottom 0.305: LED1.2
  Bottom 0.406: v38.1,47.62 38.1,47.75 37.21,47.75 31.5,53.47 23.75,53.47 19.94,49.66 v17.82,49.66 | v44.75,44.25 45.66,44.25 49.09,40.83 49.09,38.33 49.64,37.78 49.64,35.69 v49.7,35.62 49.15,35.07 49.15,33.53 51.82,30.86 51.82,30.23 60.02,22.02 60.02,19.19 60.15,19.19 66.48,12.86 66.48,10.58 | LED1.2 62.87,5.59 66.48,9.21 66.48,10.58 | LED1.2 62.08,5.03 60.73,3.68 53.34,3.68 LED2.2 53.34,4.08 52.95,3.68 46.53,3.68 LED3.2 43.71,4.7 36.78,4.7 LED4.2 34.98,4.7 28.05,4.7 LED5.2 | v66.4,10.67 66.48,10.58
VBAT
  Top 0.305: 44.07,36.39 44.07,33.43 44.45,33.05 46.46,33.05 R1.8
  Top 0.406: 44.07,36.39 C3.1 U3.3 43.24,39.49 44.4,40.66 Q1.3 46.24,40.66 47.9,42.31 X1.2 51.61,42.31 51.63,42.29 51.63,37.85 MS1.28 MS1.28B
VBUS  (via drill 0.5)
  Top 0.254: 44.51,50.67 44.5,50.67 44.06,50.22 44.06,49.24 X3.VBUS
  Top 0.305: D4.A 46.67,47.12 46.44,47.35 46.39,47.35 45.57,48.17 45.13,48.17 X3.VBUS
  Top 0.406: v49.91,47.12 D4.A | U3.4 43.47,41.66 45.8,41.66 Q1.1 46.8,43.62 v47.18,44.01 | R1.3 48.54,34.37 49,34.37 49.66,33.72 50.16,33.72 v50.16,33.78 51.44,32.51 MS1.26 MS1.26B | CHG.A 37.05,53.59 44.13,53.59 44.64,53.09 44.64,50.8 44.51,50.67
  Bottom 0.406: v49.91,47.12 49.85,47.12 49.85,43.94 | 49.85,43.94 49.85,38.48 50.61,37.72 50.61,34.42 50.16,33.97 v50.16,33.78 | v47.18,44.01 49.78,44.01 49.85,43.94
VCC  (via drill 0.5)
  Top 0.305: R4.1 52.29,6.19 52.69,6.58 54.48,6.58 54.89,6.17 R4.4 v55.68,6.48 v55.69,6.48 | 61.02,4.76 60.58,4.32 58.1,4.32 57.4,5.02 57.4,6.03 v57.39,6.02
  Top 0.406: NEOPIX.2 v24.64,3.87 | SENSE.2 61.02,4.76 v62.1,3.68 63.63,3.68 64.07,4.13 66.42,4.13 67.06,3.49 67.06,3.37 | I2C.2 43.86,9.79 43.5,10.16 38.67,10.16 38.16,9.65 38.16,4.51 38.97,3.7 v38.99,3.7 | 67.06,3.37 C10.1 | SJ1.2 70.04,4.25 69.15,3.37 67.06,3.37
  Bottom 0.305: v57.39,6.02 56.93,6.48 v55.69,6.48
  Bottom 0.406: v62.1,3.68 61.45,3.04 45.13,3.04 44.46,3.7 v38.99,3.7 38.82,3.87 v24.64,3.87
VDDCORE2
  Top 0.254: U$24.53 44.36,30.34 43.84,30.86 43.84,32.96 43.01,33.78 C19.1 43.01,35.33 C18.1